# EasyEDA Pro project ProPrj_rk3568B2_2026-10-28.epro, board PCB1
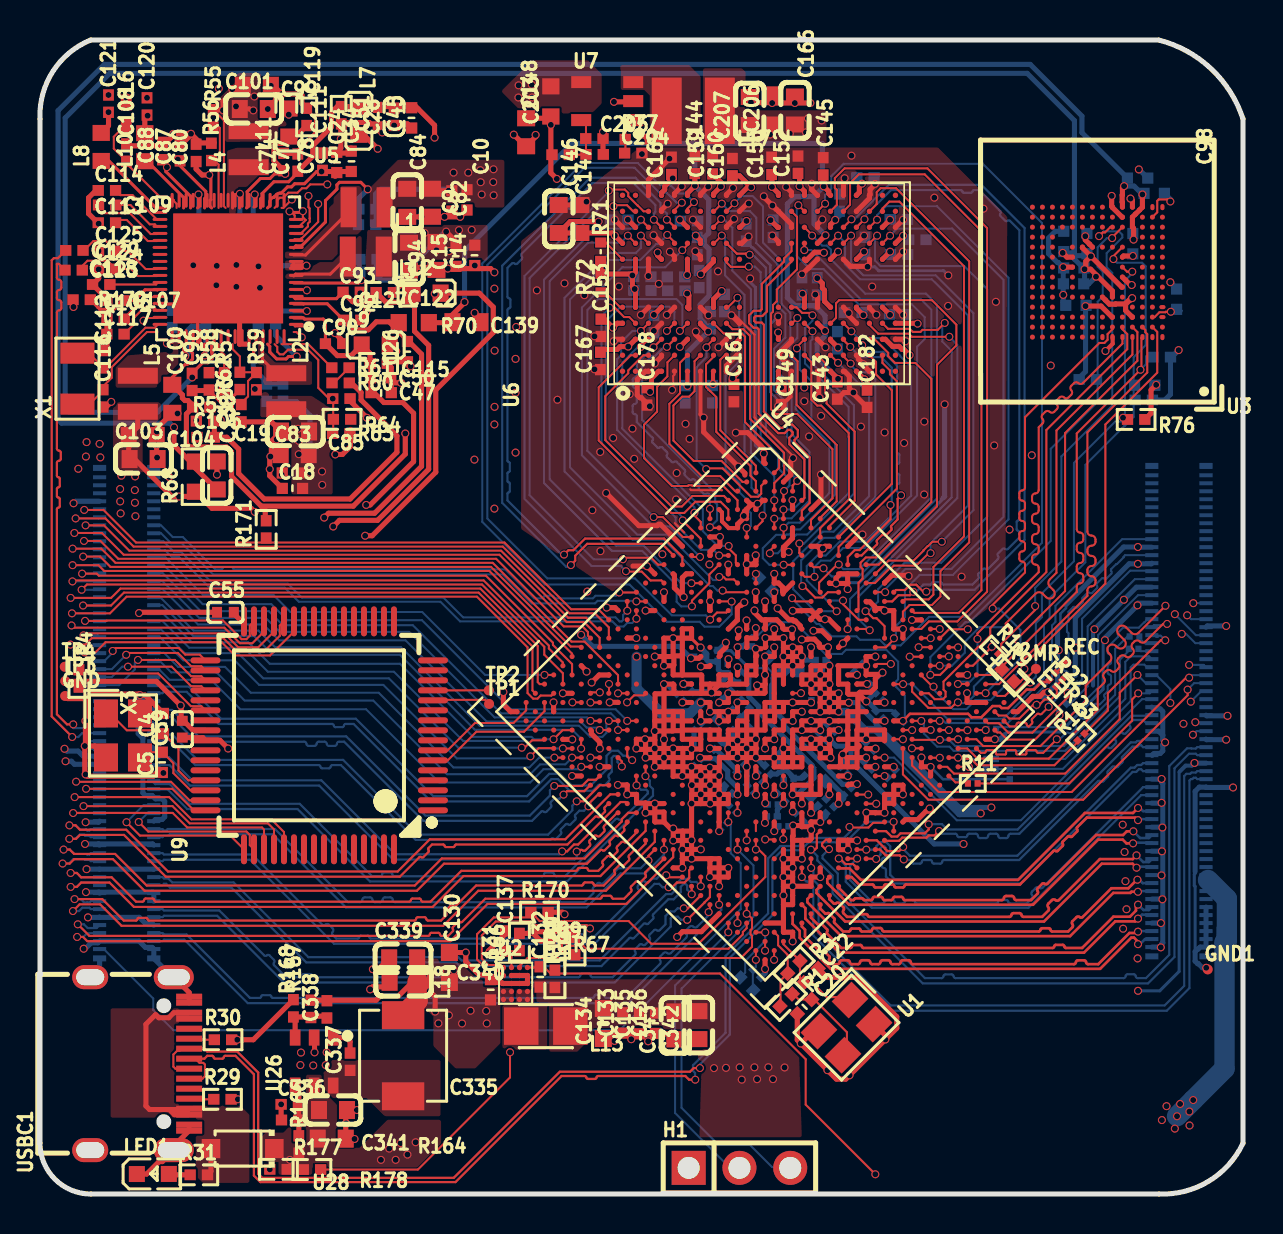
[diagram p19: board, top side]
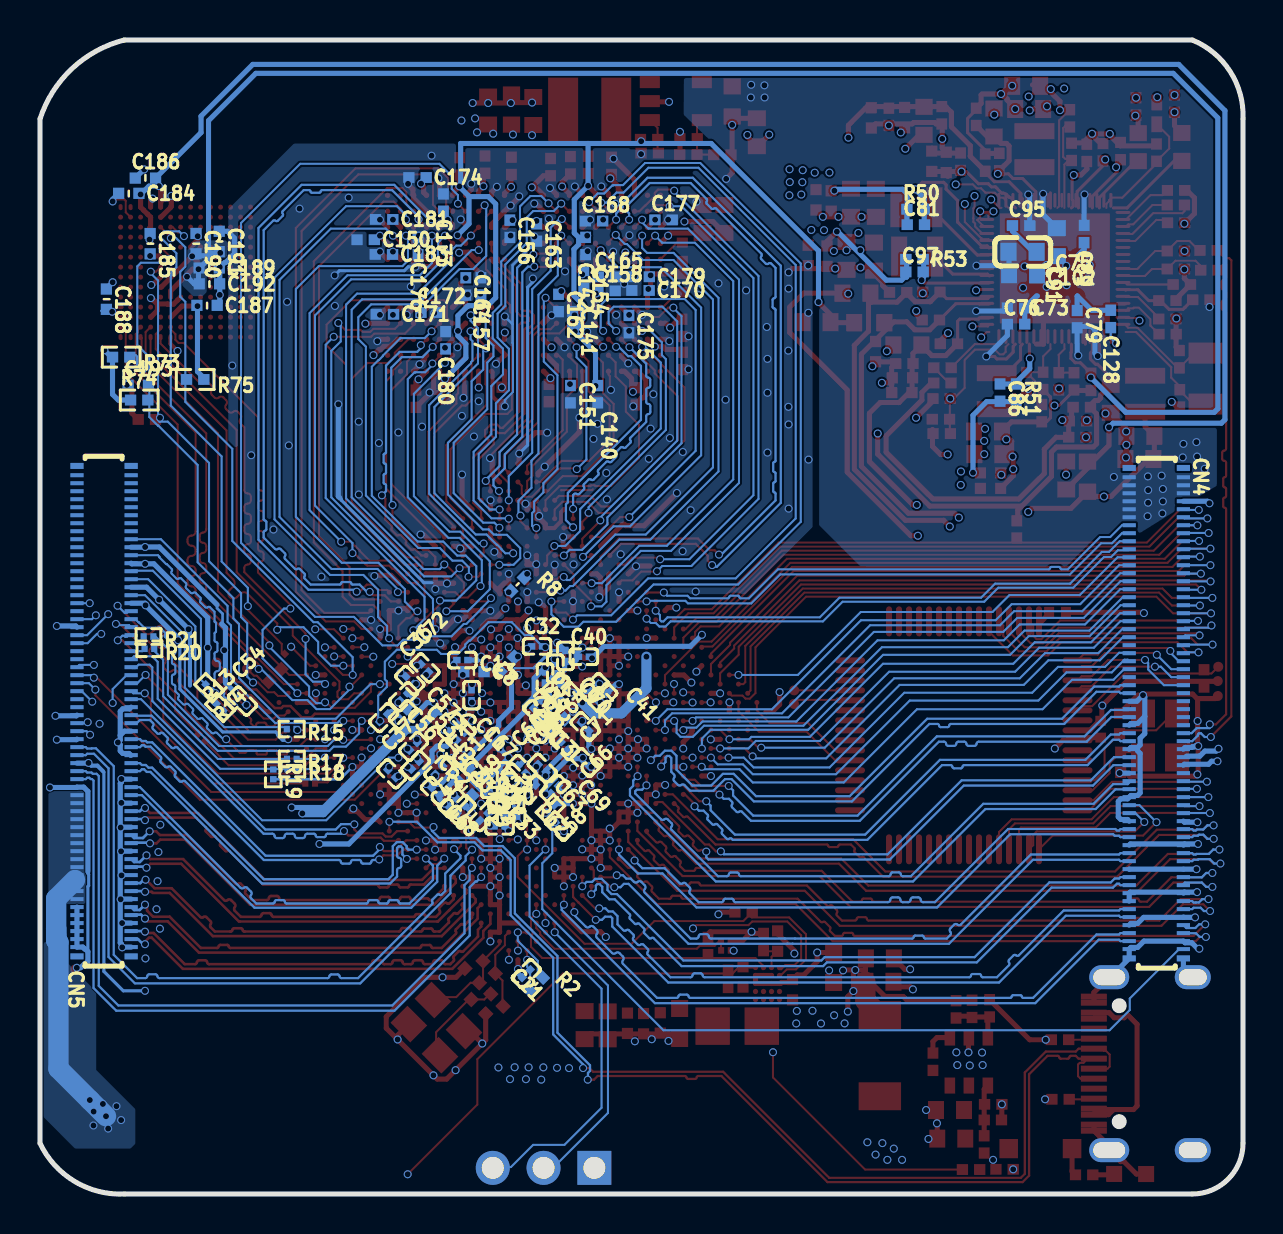
[diagram p20: board, bottom side, seen from below]

Outline 60.17 x 57.72 mm; copper layers: Top Layer, GND1, Inner2, Inner3, GND2, Bottom Layer. Coordinates in mm from the lower left corner of the outline.
Outline path: 0,53.77 arc(0.64,56.15) 2.54,57.72 55.94,57.72 arc(58.56,56.29) 60.17,53.77 60.17,2.54 arc(58.44,0.63) 55.94,0 2.54,0 arc(0.74,0.74) 0,2.54 0,53.77
Stack: Top Layer 0.035mm 外层铜厚1oz / Dielectric1 0.0994mm 3313 RC57% 4.2mil / GND1 0.0152mm 内层铜厚 / Dielectric2 0.55mm 0.55mm H/H No copper / Inner2 0.0152mm 内层铜厚 / Dielectric3 0.1088mm 2116 RC54% 4.9mil / Inner3 0.0152mm 内层铜厚 / Dielectric4 0.55mm 0.55mm H/H No copper / GND2 0.0152mm 内层铜厚 / Dielectric5 0.0994mm 3313 RC57% 4.2mil / Bottom Layer 0.035mm 外层铜厚1oz

## Design rules (mm)
net VDD_CPU: POWER
net GND: POWER
net VDD_LOGIC: POWER
net VDD_GPU: POWER
net VDD_NPU: POWER
net VCC3V3_PMU: POWER
net VDDA0V9_PMU: POWER
net VCCA1V8_PMU: POWER
net VDDA_0V9: POWER
net VCCA_1V8: POWER
net VCCIO_SD: POWER
net VCCIO_FLASH: POWER
net VCC_3V3: POWER
net USB_AVDD_1V8: POWER
net USB_AVDD_0V9: POWER
net VCCIO_WL: POWER
net VCC_1V8: POWER
net VDDA0V9_IMAGE: POWER
net VCCA1V8_IMAGE: POWER
net MIPI_AVDD_0V9: POWER
net MIPI_AVDD_1V8: POWER
net VCCIO_ACODEC: POWER
net VCC3V3_SYS: POWER
net VCC3V3_SD: POWER
net VCC_DDR: POWER
net SPKP_OUT: DP40
net SPKN_OUT: DP40
net MIC1_INP: DP39
net MIC1_INN: DP39
net VCC1V8_DDR: POWER
net VCC0V6_DDR: POWER
net EMMC_RSTN/FSPI_D2/FLASH_WPN: emmc
net MIPI_CSI_RX_D3P: DP28
net HDMI_TX0P_PORT: DP19
net MIPI_CSI_RX_D3N: DP28
net HDMI_TX0N_PORT: DP19
net MIPI_DSI_TX0_D0N/LVDS_TX0_D0N: DP25
net HDMI_TXCLKP_PORT: DP20
net MIPI_DSI_TX0_D0P/LVDS_TX0_D0P: DP25
net HDMI_TXCLKN_PORT: DP20
net MIPI_DSI_TX0_CLKN/LVDS_TX0_CLKN: DP26
net MIPI_DSI_TX0_D1N/LVDS_TX0_D1N: DP21
net MIPI_DSI_TX0_CLKP/LVDS_TX0_CLKP: DP26
net MIPI_DSI_TX0_D1P/LVDS_TX0_D1P: DP21
net MIPI_DSI_TX0_D3N/LVDS_TX0_D3N: DP24
net MIPI_DSI_TX0_D2N/LVDS_TX0_D2N: DP22
net MIPI_DSI_TX0_D3P/LVDS_TX0_D3P: DP24
net MIPI_DSI_TX0_D2P/LVDS_TX0_D2P: DP22
net MIPI_CSI_RX_D1N: DP27
net MIPI_CSI_RX_D0N: DP23
net MIPI_CSI_RX_D1P: DP27
net MIPI_CSI_RX_D0P: DP23
net MIPI_CSI_RX_CLK0N: DP29
net MIPI_CSI_RX_CLK0P: DP29
net MIPI_CSI_RX_CLK1N: DP30
net MIPI_CSI_RX_CLK1P: DP30
net USB2_HOST3_DP: DP38
net USB2_HOST3_DM: DP38
net USB2_HOST2_DP: DP37
net USB2_HOST2_DM: DP37
net MIPI_CSI_RX_D2P: DP34
net HDMI_TX1N_PORT: DP11
net MIPI_CSI_RX_D2N: DP34
net HDMI_TX1P_PORT: DP11
net HDMI_TX2N_PORT: DP10
net HDMI_TX2P_PORT: DP10
net GMAC0_RXCLK: PHYRXD
net GMAC0_TXD2: PHYTXD
net GMAC0_TXD3: PHYTXD
net GMAC0_RXDV_CRS: PHYRXD
net GMAC0_TXCLK: PHYTXD
net GMAC0_RXD2: PHYRXD
net GMAC0_RXD3: PHYRXD
net GMAC0_RXD0: PHYRXD
net GMAC0_TXD0: PHYTXD
net GMAC0_TXD1: PHYTXD
net GMAC0_RXD1: PHYRXD
net GMAC0_TXEN: PHYTXD
net USB3_OTG0_DP: DP31
net USB3_OTG0_DM: DP31
net USB3_OTG0_SSRXN: DP18
net USB3_HOST1_DP: DP35
net USB3_OTG0_SSRXP: DP18
net USB3_HOST1_DM: DP35
net USB3_OTG0_SSTXN: DP17
net PCIE20_REFCLKP: DP33
net USB3_OTG0_SSTXP: DP17
net PCIE20_REFCLKN: DP33
net USB3_HOST1_SSRXN: DP16
net PCIE30_REFCLKP_IN: DP32
net USB3_HOST1_SSRXP: DP16
net PCIE30_REFCLKN_IN: DP32
net USB3_HOST1_SSTXN: DP15
net USB3_HOST1_SSTXP: DP15
net PCIE20_TXP: DP14
net PCIE20_TXN: DP14
net PCIE20_RXP: DP13
net PCIE20_RXN: DP13
net PCIE30_TX0N: DP12
net PCIE30_TX0P: DP12
net PCIE30_TX1N: DP9
net PCIE30_TX1P: DP9
net PCIE30_RX0N: DP8
net PCIE30_RX0P: DP8
net PCIE30_RX1N: DP7
net PCIE30_RX1P: DP7
net VCC3V0_RTC: POWER
net EMMC_D0/FLASH_D0: emmc
net EMMC_CLKOUT/FLASH_DQS: emmc
net EMMC_CMD/FLASH_WRN: emmc
net EMMC_DATA_STROBE/FLASH_CLE: emmc
net EMMC_D1/FLASH_D1: emmc
net EMMC_D2/FLASH_D2: emmc
net EMMC_D3/FLASH_D3: emmc
net EMMC_D4/FLASH_D4: emmc
net EMMC_D5/FLASH_D5: emmc
net EMMC_D6/FLASH_D6: emmc
net EMMC_D7/FLASH_D7: emmc
net DDR_A_CS0: CMD_ADDR_CH_A
net DDR_A1_A: CMD_ADDR_CH_A
net DDR_A_CS1: CMD_ADDR_CH_A
net DDR_A_ODTCA: CMD_ADDR_CH_A
net DDR_A_CLKN: CMD_ADDR_CH_A, DP3
net DDR_DQ3_A: Data_CH_A_Byte0
net DDR_A_CKE0: CMD_ADDR_CH_A
net DDR_A0_A: CMD_ADDR_CH_A
net DDR_A_CLKP: CMD_ADDR_CH_A, DP3
net DDR_B_CLKN: CMD_ADDR_CH_B, DP2
net DDR_DQ1_A: Data_CH_A_Byte0
net DDR_A3_A: CMD_ADDR_CH_A
net DDR_DQ2_A: Data_CH_A_Byte0
net DDR_A4_A: CMD_ADDR_CH_A
net DDR_B_CLKP: CMD_ADDR_CH_B, DP2
net DDR_DQ0_A: Data_CH_A_Byte0
net DDR_A1_B: CMD_ADDR_CH_B
net DDR_A_DQS0P: Data_CH_A_Byte0, DP6
net DDR_A2_A: CMD_ADDR_CH_A
net DDR_A5_B: CMD_ADDR_CH_B
net DDR_A5_A: CMD_ADDR_CH_A
net DDR_A_DQS0N: Data_CH_A_Byte0, DP6
net DDR_B_ODTCA: CMD_ADDR_CH_B
net DDR_DQ6_A: Data_CH_A_Byte0
net DDR_A_CKE1: CMD_ADDR_CH_A
net DDR_A0_B: CMD_ADDR_CH_B
net DDR_B_CKE0: CMD_ADDR_CH_B
net DDR_DQ4_A: Data_CH_A_Byte0
net DDR_DQ1_B: Data_CH_B_Byte0
net DDR_B_CKE1: CMD_ADDR_CH_B
net DDR_DQ5_A: Data_CH_A_Byte0
net DDR_A_DQS1N: Data_CH_A_Byte1, DP1
net DDR_B_CS0: CMD_ADDR_CH_B
net DDR_DQ7_A: Data_CH_A_Byte0
net DDR_DQ12_A: Data_CH_A_Byte1
net DDR_DQ0_B: Data_CH_B_Byte0
net DDR_B_DQS0P: Data_CH_B_Byte0, DP4
net DDR_DQ8_A: Data_CH_A_Byte1
net DDR_DM0_A: Data_CH_A_Byte0
net DDR_A3_B: CMD_ADDR_CH_B
net DDR_DM1_A: Data_CH_A_Byte1
net DDR_B_CS1: CMD_ADDR_CH_B
net DDR_B_DQS0N: Data_CH_B_Byte0, DP4
net DDR_DQ4_B: Data_CH_B_Byte0
net DDR_A_DQS1P: Data_CH_A_Byte1, DP1
net DDR_DQ13_B: Data_CH_B_Byte1
net DDR_A4_B: CMD_ADDR_CH_B
net DDR_DQ13_A: Data_CH_A_Byte1
net DDR_DQ15_A: Data_CH_A_Byte1
net DDR_DQ12_B: Data_CH_B_Byte1
net DDR_DQ9_A: Data_CH_A_Byte1
net DDR_DQ15_B: Data_CH_B_Byte1
net DDR_DQ14_A: Data_CH_A_Byte1
net DDR_DQ2_B: Data_CH_B_Byte0
net DDR_A2_B: CMD_ADDR_CH_B
net DDR_B_DQS1N: Data_CH_B_Byte1, DP5
net DDR_DQ3_B: Data_CH_B_Byte0
net DDR_DQ11_A: Data_CH_A_Byte1
net DDR_RESET: CMD_ADDR_CH_B
net DDR_DQ8_B: Data_CH_B_Byte1
net DDR_B_DQS1P: Data_CH_B_Byte1, DP5
net DDR_DM0_B: Data_CH_B_Byte0
net DDR_DQ10_A: Data_CH_A_Byte1
net DDR_DQ10_B: Data_CH_B_Byte1
net DDR_DQ7_B: Data_CH_B_Byte0
net DDR_DQ9_B: Data_CH_B_Byte1
net DDR_DQ5_B: Data_CH_B_Byte0
net DDR_DQ11_B: Data_CH_B_Byte1
net DDR_DQ6_B: Data_CH_B_Byte0
net DDR_DQ14_B: Data_CH_B_Byte1
net DDR_DM1_B: Data_CH_B_Byte1
net VCC5V0_SYS: POWER
spacing copperThickness1oz (default): track to track 0.102, other pairs 0.089 to 0.3
spacing copperThickness2oz: track to track 0.203, other pairs 0.152 to 0.3
spacing 3W: track to track 0.102, other pairs 0.089 to 0.3
spacing Plane_innerPlane: track to track 0.102, other pairs 0.089 to 0.3
spacing Copper_copperRegion: track to track 0.102, other pairs 0.089 to 0.3
track width copperThickness2oz: min 0.203, default 0.254, max 2.54
track width 50ohm (default): min 0.102, default 0.102, max 2.54
track width trackWidth1: min 0.127, default 0.254, max 2.54
track width PWR: min 0.102, default 0.254, max 2.54
track width trackWidth2: min 0.127, default 0.254, max 2.54
differential pair differentialPair: width min 0.127, default 0.254, max 2.54; gap min 0.152, default 0.152
differential pair 90: width min 0.102, default 0.112, max 2.54; gap min 0.102, default 0.102
differential pair 100 (default): width min 0.109, default 0.109, max 2.54; gap min 0.152, default 0.152
differential pair 85: width min 0.127, default 0.131, max 2.54; gap min 0.102, default 0.102
net class POWER uses PWR
net class CMD_ADDR_CH_A uses 3W
net class Data_CH_A_Byte0 uses 3W
net class CMD_ADDR_CH_B uses 3W
net class Data_CH_B_Byte0 uses 3W
net class Data_CH_A_Byte1 uses 3W
net class Data_CH_B_Byte1 uses 3W
net VDD_CPU uses PWR
net GND uses PWR
net VDD_LOGIC uses PWR
net VDD_GPU uses PWR
net VDD_NPU uses PWR
net VCC3V3_PMU uses PWR
net VDDA0V9_PMU uses PWR
net VCCA1V8_PMU uses PWR
net VDDA_0V9 uses PWR
net VCCA_1V8 uses PWR
net VCCIO_SD uses PWR
net VCCIO_FLASH uses PWR
net VCC_3V3 uses PWR
net USB_AVDD_1V8 uses PWR
net USB_AVDD_0V9 uses PWR
net VCCIO_WL uses PWR
net VCC_1V8 uses PWR
net VDDA0V9_IMAGE uses PWR
net VCCA1V8_IMAGE uses PWR
net MIPI_AVDD_0V9 uses PWR
net MIPI_AVDD_1V8 uses PWR
net VCCIO_ACODEC uses PWR
net VCC3V3_SYS uses PWR
net VCC3V3_SD uses PWR
net VCC_DDR uses PWR
net SPKP_OUT uses differentialPair
net SPKN_OUT uses differentialPair
net VCC1V8_DDR uses PWR
net VCC0V6_DDR uses PWR
net USB2_HOST3_DP uses 90
net USB2_HOST3_DM uses 90
net USB2_HOST2_DP uses 90
net USB2_HOST2_DM uses 90
net USB3_OTG0_DP uses 90
net USB3_OTG0_DM uses 90
net USB3_OTG0_SSRXN uses 90
net USB3_HOST1_DP uses 90
net USB3_OTG0_SSRXP uses 90
net USB3_HOST1_DM uses 90
net USB3_OTG0_SSTXN uses 90
net USB3_OTG0_SSTXP uses 90
net USB3_HOST1_SSRXN uses 90
net USB3_HOST1_SSRXP uses 90
net USB3_HOST1_SSTXN uses 90
net USB3_HOST1_SSTXP uses 90
net PCIE20_TXP uses 85
net PCIE20_TXN uses 85
net PCIE20_RXP uses 85
net PCIE20_RXN uses 85
net PCIE30_TX0N uses 85
net PCIE30_TX0P uses 85
net PCIE30_TX1N uses 85
net PCIE30_TX1P uses 85
net PCIE30_RX0N uses 85
net PCIE30_RX0P uses 85
net PCIE30_RX1N uses 85
net PCIE30_RX1P uses 85
net VCC3V0_RTC uses PWR
net DDR_A_CS0 uses 3W, copperRegion_3W
net DDR_A1_A uses 3W, copperRegion_3W
net DDR_A_CS1 uses 3W, copperRegion_3W
net DDR_A_ODTCA uses 3W, copperRegion_3W
net DDR_A_CLKN uses 3W, copperRegion_3W
net DDR_DQ3_A uses 3W, copperRegion_3W
net DDR_A_CKE0 uses 3W, copperRegion_3W
net DDR_A0_A uses 3W, copperRegion_3W
net DDR_A_CLKP uses 3W, copperRegion_3W
net DDR_B_CLKN uses 3W, copperRegion_3W
net DDR_DQ1_A uses 3W, copperRegion_3W
net DDR_A3_A uses 3W, copperRegion_3W
net DDR_DQ2_A uses 3W, copperRegion_3W
net DDR_A4_A uses 3W, copperRegion_3W
net DDR_B_CLKP uses 3W, copperRegion_3W
net DDR_DQ0_A uses 3W, copperRegion_3W
net DDR_A1_B uses 3W, copperRegion_3W
net DDR_A_DQS0P uses 3W, copperRegion_3W
net DDR_A2_A uses 3W, copperRegion_3W
net DDR_A5_B uses 3W, copperRegion_3W
net DDR_A5_A uses 3W, copperRegion_3W
net DDR_A_DQS0N uses 3W, copperRegion_3W
net DDR_B_ODTCA uses 3W, copperRegion_3W
net DDR_DQ6_A uses 3W, copperRegion_3W
net DDR_A_CKE1 uses 3W, copperRegion_3W
net DDR_A0_B uses 3W, copperRegion_3W
net DDR_B_CKE0 uses 3W, copperRegion_3W
net DDR_DQ4_A uses 3W, copperRegion_3W
net DDR_DQ1_B uses 3W, copperRegion_3W
net DDR_B_CKE1 uses 3W, copperRegion_3W
net DDR_DQ5_A uses 3W, copperRegion_3W
net DDR_A_DQS1N uses 3W, copperRegion_3W
net DDR_B_CS0 uses 3W, copperRegion_3W
net DDR_DQ7_A uses 3W, copperRegion_3W
net DDR_DQ12_A uses 3W, copperRegion_3W
net DDR_DQ0_B uses 3W, copperRegion_3W
net DDR_B_DQS0P uses 3W, copperRegion_3W
net DDR_DQ8_A uses 3W, copperRegion_3W
net DDR_DM0_A uses 3W, copperRegion_3W
net DDR_A3_B uses 3W, copperRegion_3W
net DDR_DM1_A uses 3W, copperRegion_3W
net DDR_B_CS1 uses 3W, copperRegion_3W
net DDR_B_DQS0N uses 3W, copperRegion_3W
net DDR_DQ4_B uses 3W, copperRegion_3W
net DDR_A_DQS1P uses 3W, copperRegion_3W
net DDR_DQ13_B uses 3W, copperRegion_3W
net DDR_A4_B uses 3W, copperRegion_3W
net DDR_DQ13_A uses 3W, copperRegion_3W
net DDR_DQ15_A uses 3W, copperRegion_3W
net DDR_DQ12_B uses 3W, copperRegion_3W
net DDR_DQ9_A uses 3W, copperRegion_3W
net DDR_DQ15_B uses 3W, copperRegion_3W
net DDR_DQ14_A uses 3W, copperRegion_3W
net DDR_DQ2_B uses 3W, copperRegion_3W
net DDR_A2_B uses 3W, copperRegion_3W
net DDR_B_DQS1N uses 3W, copperRegion_3W
net DDR_DQ3_B uses 3W, copperRegion_3W
net DDR_DQ11_A uses 3W, copperRegion_3W
net DDR_RESET uses 3W, copperRegion_3W
net DDR_DQ8_B uses 3W, copperRegion_3W
net DDR_B_DQS1P uses 3W, copperRegion_3W
net DDR_DM0_B uses 3W, copperRegion_3W
net DDR_DQ10_A uses 3W, copperRegion_3W
net DDR_DQ10_B uses 3W, copperRegion_3W
net DDR_DQ7_B uses 3W, copperRegion_3W
net DDR_DQ9_B uses 3W, copperRegion_3W
net DDR_DQ5_B uses 3W, copperRegion_3W
net DDR_DQ11_B uses 3W, copperRegion_3W
net DDR_DQ6_B uses 3W, copperRegion_3W
net DDR_DQ14_B uses 3W, copperRegion_3W
net DDR_DM1_B uses 3W, copperRegion_3W
net VCC5V0_SYS uses PWR, copperRegion_copperThickness1oz
pour e2772 uses Copper_copperRegion, copperRegion_Copper_copperRegion
pour e2895 uses Copper_copperRegion, copperRegion_Copper_copperRegion
pour e3185 uses Copper_copperRegion, copperRegion_Copper_copperRegion
pour e3187 uses Copper_copperRegion, copperRegion_Copper_copperRegion
pour e3189 uses Copper_copperRegion, copperRegion_Copper_copperRegion
pour e3194 uses Copper_copperRegion, copperRegion_Copper_copperRegion
pour e3209 uses Copper_copperRegion, copperRegion_Copper_copperRegion
diff pair DP7 uses 85
diff pair DP8 uses 85
diff pair DP9 uses 85
pour e3235 uses Copper_copperRegion, copperRegion_Copper_copperRegion
diff pair DP12 uses 85
diff pair DP13 uses 85
diff pair DP14 uses 85
diff pair DP15 uses 90
diff pair DP16 uses 90
diff pair DP17 uses 90
diff pair DP18 uses 90
pour e3281 uses Copper_copperRegion, copperRegion_Copper_copperRegion
pour e3283 uses Copper_copperRegion, copperRegion_Copper_copperRegion
pour e3286 uses Copper_copperRegion, copperRegion_Copper_copperRegion
pour e3291 uses Copper_copperRegion, copperRegion_Copper_copperRegion
pour e3335 uses Copper_copperRegion, copperRegion_Copper_copperRegion
pour e3337 uses Copper_copperRegion, copperRegion_Copper_copperRegion
pour e3358 uses Copper_copperRegion, copperRegion_Copper_copperRegion
pour e3393 uses Copper_copperRegion, copperRegion_Copper_copperRegion
pour e3466 uses Copper_copperRegion, copperRegion_Copper_copperRegion
pour e3473 uses Copper_copperRegion, copperRegion_Copper_copperRegion
pour e3479 uses Copper_copperRegion, copperRegion_Copper_copperRegion
pour e3539 uses Copper_copperRegion, copperRegion_Copper_copperRegion
pour e3579 uses Copper_copperRegion, copperRegion_Copper_copperRegion
pour e3586 uses Copper_copperRegion, copperRegion_Copper_copperRegion
pour e3920 uses Copper_copperRegion, copperRegion_Copper_copperRegion
pour e3942 uses Copper_copperRegion, copperRegion_Copper_copperRegion
pour e3955 uses Copper_copperRegion, copperRegion_Copper_copperRegion
pour e4399 uses Copper_copperRegion, copperRegion_Copper_copperRegion
pour e4403 uses Copper_copperRegion, copperRegion_Copper_copperRegion
pour e4421 uses Copper_copperRegion, copperRegion_Copper_copperRegion
pour e4460 uses Copper_copperRegion, copperRegion_Copper_copperRegion
pour e4515 uses Copper_copperRegion, copperRegion_Copper_copperRegion
diff pair DP31 uses 90
diff pair DP35 uses 90
pour e4835 uses Copper_copperRegion, copperRegion_Copper_copperRegion
diff pair DP37 uses 90
diff pair DP38 uses 90
pour e4881 uses Copper_copperRegion, copperRegion_Copper_copperRegion
pour e4897 uses Copper_copperRegion, copperRegion_Copper_copperRegion
pour e6538 uses Copper_copperRegion, copperRegion_Copper_copperRegion
pour e9331 uses Copper_copperRegion, copperRegion_Copper_copperRegion
pour e9360 uses Copper_copperRegion, copperRegion_Copper_copperRegion
pour e9367 uses Copper_copperRegion, copperRegion_Copper_copperRegion
diff pair DP40 uses differentialPair

## Placement (name value [footprint] x y rotation side)
C1  0.1uF  [C0201]  39.04 26.71 0 bottom
C2  4.7uF  [C0201]  38.58 24.95 90 bottom
C3  22uF  [c0402-nsk]  38.46 26.13 0 bottom
C4  12pF  [c0402-nsk]  6.17 23.53 90 top
C5  12pF  [c0402-nsk]  6.12 21.59 90 top
C6  0.1uF  [C0201]  34.37 25.35 315 bottom
C7  4.7uF  [C0201]  33.91 24.91 315 bottom
C8  22uF  [c0402-nsk]  36.8 26.49 135 bottom
C9  22uF  [c0402-nsk]  21.36 49.72 90 top
C10  22uF  [c0402-nsk]  20.6 49.67 90 top
C11  0.1uF  [C0201]  34.85 24.02 135 bottom
C12  4.7uF  [C0201]  35.29 24.51 135 bottom
C13  22uF  [c0402-nsk]  34.29 23.4 135 bottom
C14  22uF  [c0402-nsk]  21.75 46.95 90 top
C15  22uF  [c0402-nsk]  20.81 46.9 90 top
C16  0.1uF  [C0201]  39.54 23.33 315 bottom
C17  4.7uF  [C0201]  39.12 22.89 315 bottom
C18  22uF  [c0402-nsk]  12.63 35.29 0 top
C19  22uF  [c0402-nsk]  12.62 36.07 0 top
C20  12pF  [c0402-nsk]  38.23 9.37 225 top
C21  100nF  [C0201]  35.85 11.02 135 bottom
C22  12pF  [c0402-nsk]  38.56 10.92 225 top
C23  100nF  [C0201]  36.65 19.48 180 bottom
C24  1uF  [c0402-nsk]  14.84 51.6 270 top
C25  100nF  [C0201]  37.06 19.85 135 bottom
C26  1uF  [c0402-nsk]  18.38 42.13 90 top
C27  100nF  [C0201]  37.18 18.39 180 bottom
C28  1uF  [C0402]  17.71 53.88 90 top
C29  100nF  [C0201]  34.91 25.83 90 bottom
C30  100nF  [C0201]  36.6 18.88 180 bottom
C31  1uF  [c0402-nsk]  38.92 20.28 225 bottom
C32  100nF  [C0201]  35.31 27.39 180 bottom
C33  100nF  [C0201]  37.96 18.87 315 bottom
C34  1uF  [c0402-nsk]  15.57 51.65 270 top
C35  100nF  [C0201]  41.48 22.39 315 bottom
C36  100nF  [C0201]  41.67 25.69 225 bottom
C37  100nF  [C0201]  42.58 21.02 225 bottom
C38  100nF  [C0201]  34.39 26.28 90 bottom
C39  100nF  [C0201]  33.89 26.91 90 bottom
C40  100nF  [C0201]  32.96 26.87 180 bottom
C41  100nF  [C0201]  32.02 24.83 315 bottom
C42  100nF  [C0201]  40.39 20.13 45 bottom
C43  100nF  [C0201]  40.22 21.19 315 bottom
C44  100nF  [C0201]  37.69 20.52 270 bottom
C45  4.7uF  [c0402-nsk]  18.59 53.82 90 top
C46  100nF  [C0201]  39.51 19.56 135 bottom
C47  4.7uF  [c0402-nsk]  17.06 40.08 180 top
C48  100nF  [C0201]  39.11 19.23 135 bottom
C49  100nF  [C0201]  38.42 21.11 45 bottom
C50  4.7uF  [c0402-nsk]  17.03 40.83 180 top
C51  4.7uF  [c0402-nsk]  16.92 53.84 90 top
C52  100nF  [C0201]  41.39 21.44 315 bottom
C53  100nF  [C0201]  42 23.97 315 bottom
C54  1nF  [C0201]  50.04 24.66 225 bottom
C55  470nF  [C0402_1]  9.27 29.09 0 top
C56  100nF  [C0201]  42.98 23.82 315 bottom
C57  100nF  [C0201]  41.98 24.87 315 bottom
C58  100nF  [C0201]  34.19 18.39 45 bottom
C59  100nF  [C0402_1]  7.12 23.25 90 top
C60  0.1uF  [C0201]  36.06 21.24 225 bottom
C61  1uF  [C0201]  36.35 20.81 225 bottom
C63  0.1uF  [C0201]  35.55 20.24 310.9 bottom
C64  0.1uF  [C0201]  33.91 22.43 225 bottom
C66  0.1uF  [C0201]  32.89 21.58 45 bottom
C68  100nF  [C0201]  35.05 21.3 225 bottom
C69  100nF  [C0201]  34.43 20.23 315 bottom
C70  100nF  [C0201]  32.44 25.32 135 bottom
C71  100nF  [C0201]  32.91 23.38 45 bottom
C72  0.1uF  [C0201]  40.91 26.31 225 bottom
C73  1uF  [R0402_2]  11.36 44.32 0 bottom
C74  1uF  [R0402_2]  12.19 51.62 90 top
C75  22uF  [C0603_2]  11.02 47.12 0 bottom
C76  10uF  [R0402_2]  11.35 43.51 180 bottom
C77  1uF  [R0402_2]  12.89 51.59 90 top
C78  1uF  [R0402_2]  14.13 51.63 90 top
C79  1uF  [R0402_2]  8.29 43.76 270 bottom
C80  1uF  [R0402_2]  7.81 52.07 90 top
C81  1uF  [R0402_2]  16.36 48.48 180 bottom
C82  10uF  [C0603_3]  19.61 49.58 90 top
C83  10uF  [C0603_3]  12.74 37.01 0 top
C84  22uF  [C0603_2]  18.37 49.57 270 top
C85  22uF  [C0603_2]  12.76 38.14 180 top
C86  1uF  [R0402_2]  12.15 40.08 270 bottom
C87  1uF  [R0402_2]  7 52.1 90 top
C88  1uF  [R0402_2]  6.13 52.16 90 top
C89  1uF  [R0402_2]  7.95 48.02 90 bottom
C90  1uF  [R0402_2]  14.71 42.53 0 top
C91  10uF  [C0603_3]  9.31 47.61 90 bottom
C92  1uF  [R0402_2]  15.62 43.71 0 top
C93  1uF  [R0402_2]  15.59 45.11 0 top
C94  10uF  [C0603_3]  19.83 46.92 90 top
C95  1uF  [R0402_2]  11.1 48.44 180 bottom
C96  1uF  [R0402_2]  7.61 40.62 270 top
C97  1uF  [R0402_2]  16.43 46.12 180 bottom
C98  22uF  [C0603_2]  18.46 46.88 270 top
C99  10uF  [C0603_3]  10.84 55.43 180 top
C100  10uF  [C0603_3]  6.62 39.77 270 top
C101  22uF  [C0603_2]  10.69 54.27 0 top
C102  10uF  [C0603_3]  11 46 0 bottom
C103  22uF  [C0603_2]  5.18 36.76 0 top
C104  10uF  [C0603_3]  5.14 37.92 180 top
C105  1uF  [R0402_2]  8.29 37.85 0 top
C106  1uF  [R0402_2]  3.78 43.77 0 top
C107  1uF  [R0402_2]  3.78 44.68 180 top
C108  10uF  [R0402_2]  4.33 52.09 270 top
C109  4.7uF  [R0402_2]  3.36 49.47 180 top
C111  100nF  [R0402_4]  15.07 53.96 90 top
C112  12pF  [R0402_3]  3.18 41.75 270 top
C113  1uF  [R0402_2]  3.35 48.58 0 top
C114  1uF  [R0402_2]  3.35 50.2 0 top
C115  100nF  [R0402_4]  16.94 41.54 180 top
C116  12pF  [R0402_3]  3.16 39.79 270 top
C117  1uF  [R0402_2]  3.77 43.01 0 top
C118  1uF  [R0402_2]  3.06 45.49 0 top
C119  100nF  [R0402_4]  13.34 53.87 270 top
C120  680pF  [R0402_2]  5.35 54.4 270 top
C121  680pF  [R0402_2]  3.43 54.54 270 top
C122  100nF  [R0402_4]  17.25 45.1 180 top
C123  100nF  [R0402_2]  1.68 46.21 180 top
C124  27pF  [R0402_2]  3.36 46.26 0 top
C125  27pF  [R0402_2]  3.36 47.17 0 top
C126  100nF  [R0402_2]  10.07 39.05 90 top
C127  100nF  [R0402_2]  15.07 39.78 180 top
C128  100nF  [R0402_2]  6.62 43.77 90 bottom
C129  100nF  [R0402_2]  1.72 47.2 180 top
C130  22uF  [c0603-nsk]  20.47 11.33 270 top
C131  100nF  [c0402-nsk]  22.53 10.22 270 top
C132  100nF  [c0402-nsk]  25.01 10.86 270 top
C133  22uF  [c0402-nsk]  29.14 8.56 90 top
C134  22uF  [c0603-nsk]  28.17 8.53 90 top
C135  1uF  [c0402-nsk]  29.98 8.52 90 top
C136  100nF  [c0402-nsk]  30.78 8.54 90 top
C137  100nF  [c0402-nsk]  23.28 12.65 270 top
C138  100nF  [C0603]  8.84 35.94 270 top
C139  10uF  [C0603_3]  21.33 43.61 180 top
C140  100nF  [R0402_2]  32.27 40 90 bottom
C141  100nF  [R0402_2]  33.53 43.7 270 bottom
C142  100nF  [R0402_2]  32.88 47.41 90 bottom
C143  100nF  [R0402_2]  39.88 40.19 90 top
C144  100nF  [R0402_2]  32.75 51.47 270 top
C145  100nF  [R0402_2]  39.17 51.4 270 top
C146  22uF  [C0603_2]  25.94 48.77 270 top
C147  10uF  [C0603_3]  27.03 48.76 270 top
C148  10uF  [C0603_3]  24.31 53.1 270 top
C149  1uF  [R0402_2]  37.07 39.92 90 top
C150  100nF  [R0402_2]  43.88 47.73 0 bottom
C151  100nF  [R0402_2]  33.63 40 270 bottom
C152  100nF  [R0402_2]  37.91 51.48 90 top
C153  100nF  [R0402_2]  28.05 43.32 270 top
C154  100nF  [R0402_2]  32.97 45.76 270 bottom
C155  100nF  [R0402_2]  36.59 51.42 90 top
C156  100nF  [R0402_2]  36.67 48.28 270 bottom
C157  100nF  [R0402_2]  38.11 45.4 90 bottom
C158  100nF  [R0402_2]  31.83 45.17 180 bottom
C159  100nF  [R0402_2]  33.64 51.45 90 top
C160  100nF  [R0402_2]  34.63 51.36 90 top
C161  100nF  [R0402_2]  34.7 40.06 270 top
C162  100nF  [R0402_2]  34.23 44.57 270 bottom
C163  100nF  [R0402_2]  35.32 48.09 270 bottom
C164  100nF  [R0402_2]  38.87 45.39 270 bottom
C165  100nF  [R0402_2]  31.81 45.87 180 bottom
C166  22uF  [C0603_2]  37.76 54.19 270 top
C167  10uF  [R0402_2]  28.03 41.67 90 top
C168  10uF  [R0402_2]  32.46 48.66 180 bottom
C169  100nF  [R0402_2]  31.58 51.43 90 top
C170  100nF  [R0402_2]  30.13 45.19 0 bottom
C171  100nF  [R0402_2]  42.92 44 0 bottom
C172  100nF  [R0402_2]  40.68 44.09 180 bottom
C173  100nF  [R0402_2]  39.99 49.59 90 bottom
C174  100nF  [R0402_2]  41.28 50.84 0 bottom
C175  100nF  [R0402_2]  30.71 43.51 270 bottom
C176  100nF  [R0402_2]  41.26 47.42 90 bottom
C177  100nF  [R0402_2]  28.98 48.72 180 bottom
C178  100nF  [R0402_2]  30.36 39.89 270 top
C179  100nF  [R0402_2]  30.12 45.88 0 bottom
C180  100nF  [R0402_2]  39.88 42.7 90 bottom
C181  100nF  [R0402_2]  42.95 48.75 0 bottom
C182  100nF  [R0402_2]  41.36 39.78 270 top
C183  100nF  [R0402_2]  42.97 46.99 0 bottom
C184  100nF  [c0402-nsk]  55.73 50.05 0 bottom
C185  4.7uF  [c0402-nsk]  54.66 47.53 270 bottom
C186  100nF  [c0402-nsk]  54.89 50.81 180 bottom
C187  4.7uF  [c0402-nsk]  51.81 44.45 0 bottom
C188  2.2uF  [c0402-nsk]  56.84 44.75 270 bottom
C189  100nF  [c0402-nsk]  51.71 46.32 0 bottom
C190  4.7uF  [c0402-nsk]  52.36 47.53 270 bottom
C191  100nF  [c0402-nsk]  51.2 47.64 270 bottom
C192  4.7uF  [c0402-nsk]  51.69 45.52 0 bottom
C193  100nF  [c0402-nsk]  55.25 40.45 180 bottom
C203  NC  [R0603_1]  25.55 54.65 90 top
C204  NC  [R0402_2]  29.67 52.06 0 top
C205  NC  [R0402_2]  27.73 52.79 0 top
C206  NC  [R0603_1]  36.59 54.24 90 top
C207  22uF  [C0603_2]  35.5 54.17 90 top
C335  100nF  [C0603]  14.65 4.2 180 top
C336  100nF  [R0402_2]  12.49 4.48 0 top
C337  100nF  [R0402_2]  15.51 6.62 90 top
C338  22pF  [R0402_2]  14.35 9.24 90 top
C339  22uF  [C0603_2]  18.16 11.79 0 top
C340  100nF  [C0603]  18.18 10.61 0 top
C341  10uF  [C0603_3]  14.59 2.77 180 top
C342  22uF  [C0603]  32.93 8.45 90 top
C343  22uF  [C0603]  31.78 8.43 90 top
CN4  DF40C-120DP-0.4V(51)  [CONN-SMD_120P-P0.40_DF40C-120DP-0.4V-51]  4.34 24.05 270 bottom
CN5  DF40C-120DP-0.4V(51)  [CONN-SMD_120P-P0.40_DF40C-120DP-0.4V-51]  56.96 24.15 90 bottom
GND  -  [Test-Point-0.5mm]  1.26 24.91 0 top
GND1  -  [Test-Point-0.5mm]  58.4 11.23 0 top
H1  -  [HDR-TH_3P-P2.54-V-M_1]  34.98 1.31 0 top
L1  470nH  [IND-SMD_L2.0-W1.6_MHCHL201610A-1R0M-Q8A]  16.33 49.35 180 top
L2  470nH  [IND-SMD_L2.0-W1.6_MHCHL201610A-1R0M-Q8A]  12.32 40.15 270 top
L3  470nH  [IND-SMD_L2.0-W1.6_MHCHL201610A-1R0M-Q8A]  16.29 46.89 180 top
L4  470nH  [IND-SMD_L2.0-W1.6_MHCHL201610A-1R0M-Q8A]  10.43 52.26 90 top
L5  470nH  [IND-SMD_L2.0-W1.6_MHCHL201610A-1R0M-Q8A]  4.89 40.03 270 top
L6  BLM15AG121SN1D  [L0402]  4.31 54.05 270 top
L7  BLM18PG121SN1D  [L0603_1]  15.95 53.68 270 top
L8  BLM18PG181SN1D  [L0603]  3.06 52.37 90 top
L9  BLM18PG121SN1D  [L0603_1]  16.79 42.46 0 top
L10  BLM18PG181SN1D  [L0603]  5.24 52.36 90 top
L11  BLM18PG121SN1D  [L0603_1]  12.45 53.59 90 top
L12  BLM18PG121SN1D  [L0603_1]  19.34 45.06 0 top
L13  240nH  [IND-SMD_L2.5-W2.0_WPN252012H]  25.3 8.4 180 top
L17  NC  [IND-SMD_L3.0-W3.0]  32.67 54.18 180 top
L18  3.3uH  [IND-SMD_L4.4-W4.2]  18.16 6.92 270 top
LED1  -  [LED_0603]  5.69 1.01 0 top
MR  -  [Test-Point-0.5mm]  49.81 26.27 0 top
R1  22R  [R0402]  37.31 9.7 225 top
R2  0Ω  [r0402-nsk]  35.34 10.5 315 bottom
R3  1M  [R0402]  37.7 11.34 225 top
R4  5.1K  [R0402_1]  1.95 25.79 270 top
R8  120Ω  [r0402-nsk]  36.28 30.49 315 bottom
R9  100  [R0402]  48.41 25.94 315 top
R10  22R  [R0201]  47.75 27.19 315 top
R11  22  [R0201]  46.65 20.54 0 top
R12  200  [R0201]  37.19 20.96 90 bottom
R13  22  [R0201]  51.71 25.32 45 bottom
R14  22  [R0201]  51.17 24.34 45 bottom
R15  22  [R0201]  47.58 23.25 0 bottom
R16  22  [R0201]  52.06 22.85 45 top
R17  22  [R0201]  47.57 21.76 0 bottom
R18  22  [R0201]  47.55 21.25 0 bottom
R19  4.7K  [R0201]  48.5 20.99 270 bottom
R20  22  [R0201]  54.69 27.27 0 bottom
R21  22  [R0201]  54.74 27.88 0 bottom
R22  10K  [R0201]  50.65 25.55 315 top
R23  100  [R0201]  50.95 25.89 135 top
R29  5.1K  [R0402_1]  9.12 4.74 0 top
R30  5.1K  [R0402_1]  9.15 7.72 0 top
R31  5.1K  [R0402_1]  7.94 0.96 0 top
R32  1.62K  [R0201]  34.64 19.25 135 bottom
R50  0402WGF1000TCE  [R0402_2]  16.38 49.26 180 bottom
R51  0402WGF1000TCE  [R0402_2]  11.34 40.08 270 bottom
R52  0Ω  [R0402_2]  8.25 38.66 0 top
R53  0402WGF1000TCE  [R0402_2]  16.43 46.75 0 bottom
R54  0Ω  [R0402_2]  8.06 39.36 0 top
R55  47kΩ  [R0402_2]  8.66 53.8 270 top
R56  120kΩ  [R0402_2]  8.57 52.12 270 top
R57  0Ω  [R0402_2]  9.22 40.65 270 top
R58  NC  [R0402_2]  8.45 40.65 270 top
R59  180kΩ  [R0402_2]  10.83 40.65 270 top
R60  10kΩ  [R0402_2]  15.04 40.57 180 top
R61  0Ω  [R0402_2]  15.03 41.33 180 top
R62  56kΩ  [R0402_2]  10 40.67 90 top
R63  10kΩ  [R0402_2]  15.07 38.03 180 top
R64  22R  [R0402]  15.11 38.75 180 top
R65  100Ω  [R0402]  25.75 10.76 270 top
R66  51kΩ  [R0402]  23.98 12.6 90 top
R67  10K  [R0201]  25.87 12.66 180 top
R68  0  [R0603]  7.78 35.88 90 top
R69  2.2K  [R0201]  25.86 12.18 0 top
R70  0Ω  [R0603_2]  18.69 43.58 180 top
R71  240  [r0402-nsk]  28.04 47.13 270 top
R72  240  [r0402-nsk]  28.06 45.56 90 top
R73  10K  [R0402]  56.11 41.86 0 bottom
R74  10K  [R0402]  55.2 39.71 180 bottom
R75  10K  [R0402]  52.41 40.74 0 bottom
R76  47K  [R0402]  54.82 38.74 180 top
R77  NC  [R0402_2]  29.7 52.75 0 top
R78  NC  [R0402_2]  27.74 52 180 top
R79  NC  [R0402_2]  26.04 51.98 180 top
R164  30kΩ  [R0402_2]  12.51 3.7 0 top
R166  47kΩ  [R0402_2]  12.94 2.48 270 top
R167  33kΩ  [R0402_2]  12.67 9.29 270 top
R168  150kΩ  [R0402_3]  13.55 9.26 90 top
R169  2K  [R0402]  26.76 12.4 90 top
R170  2K  [R0402]  24.98 14.09 0 top
R171  10K  [R0402]  11.31 33.24 90 top
R177  10K  [R0402_1]  13.6 1.22 0 top
R178  15K  [R0402_1]  11.93 1.23 0 top
R179  0Ω  [R0402_2]  2.09 44.73 180 top
REC  -  [Test-Point-0.5mm]  51.33 26.58 0 top
TP1  -  [Test-Point-0.5mm_1]  22.46 24.51 0 top
TP2  -  [Test-Point-0.5mm_1]  22.45 25.19 0 top
TP3  -  [Test-Point-0.5mm_1]  1.26 25.66 0 top
TP4  -  [Test-Point-0.5mm_1]  1.24 26.37 0 top
U1  24MHz  [CRYSTAL-SMD_4P-L3.2-W2.5-BL]  40.34 8.32 225 top
U2  -  [TCS4525]  23.18 11.33 0 top
U3  -  [fbga-153_l13.0-w11.5-p0.50_klmag1jetd-b041]  52.88 46.11 180 top
U4  -  [BGA-636_L19.0-W19.0-P0.65-BL]  36.23 24 315 top
U5  -  [RK809-5]  9.28 45.91 180 top
U6  -  [LPDDR4_MrX]  35.96 45.55 90 top
U7  NC  [SOT-23-5_L3.0-W1.7-P0.95-LS2.8-BR]  28.37 54.66 0 top
U9  MSPM0G3507SPMR  [LQFP-64_L10.0-W10.0-P0.50-LS12.0-BL_1]  13.97 22.94 90 top
U26  SY8113BADC  [TSOT-23-6_L2.9-W1.6-P0.95-LS2.8-BR]  13.71 6.62 90 top
U28  SMF5.0A  [SOD-123FL_L2.8-W1.7-LS3.6-RD]  10.13 2.27 180 top
USBC1  TYPE-C-31-M-12  [USB-C_SMD-TYPE-C-31-M-12]  4.99 6.52 270 top
X1  32.768kHz  [CRYSTAL-SMD_L3.2-W1.5-1]  1.87 40.78 90 top
X3  40MHz  [CRYSTAL-SMD_4P-L3.2-W2.5-BL_1]  4.15 22.93 270 top

## Footprints (pads in the part's own frame, mm; a bottom-side part is the same pattern mirrored in y, then rotated)
BGA-636_L19.0-W19.0-P0.65-BL
  round 0.254 smd: A1(-8.844,8.886) A2(-8.194,8.885) A3(-7.544,8.886) A4(-6.894,8.885) A5(-6.244,8.886) A6(-5.594,8.885) A7(-4.944,8.886) A8(-4.294,8.885) A9(-3.644,8.886) A10(-2.994,8.885) A11(-2.344,8.886) A12(-1.694,8.885) A13(-1.044,8.886) A14(-0.395,8.886) A15(0.256,8.886) A16(0.906,8.886) A17(1.556,8.885) A18(2.206,8.886) A19(2.856,8.885) A20(3.506,8.886) A21(4.156,8.885) A22(4.806,8.886) A23(5.456,8.885) A24(6.106,8.886) A25(6.756,8.885) A26(7.406,8.886) A27(8.056,8.885) A28(8.706,8.886) AA1(-8.844,-4.114) AA2(-8.194,-4.114) AA3(-7.544,-4.114) AA4(-6.894,-4.114) AA5(-6.244,-4.114) AA6(-5.594,-4.114) AA7(-4.944,-4.115) AA9(-3.644,-4.114) AA11(-2.345,-4.114) AA12(-1.694,-4.114) AA14(-0.394,-4.114) AA15(0.256,-4.114) AA17(1.556,-4.114) AA18(2.206,-4.114) AA20(3.506,-4.114) AA22(4.806,-4.115) AA23(5.456,-4.114) AA24(6.106,-4.114) AA25(6.756,-4.114) AA26(7.405,-4.114) AA27(8.056,-4.114) AA28(8.706,-4.114) AB1(-8.844,-4.764) AB2(-8.194,-4.764) AB5(-6.244,-4.764) AB6(-5.594,-4.764) AB8(-4.295,-4.764) AB9(-3.644,-4.764) AB11(-2.344,-4.764) AB12(-1.694,-4.764) AB14(-0.395,-4.764) AB15(0.256,-4.764) AB17(1.556,-4.764) AB18(2.206,-4.764) AB20(3.506,-4.764) AB21(4.156,-4.764) AB23(5.455,-4.764) AB24(6.106,-4.764) AB27(8.056,-4.764) AB28(8.706,-4.764) AC1(-8.844,-5.415) AC2(-8.194,-5.415) AC3(-7.544,-5.415) AC4(-6.894,-5.415) AC5(-6.244,-5.415) AC7(-4.944,-5.415) AC8(-4.294,-5.415) AC9(-3.644,-5.415) AC11(-2.345,-5.415) AC12(-1.694,-5.415) AC14(-0.394,-5.415) AC15(0.256,-5.415) AC17(1.556,-5.415) AC18(2.206,-5.415) AC20(3.506,-5.415) AC21(4.156,-5.415) AC22(4.806,-5.415) AC24(6.106,-5.415) AC25(6.756,-5.415) AC26(7.405,-5.415) AC27(8.056,-5.415) AC28(8.706,-5.415) AD1(-8.844,-6.064) AD2(-8.194,-6.064) AD3(-7.544,-6.065) AD4(-6.894,-6.064) AD6(-5.594,-6.064) AD7(-4.944,-6.064) AD8(-4.294,-6.065) AD9(-3.644,-6.064) AD11(-2.344,-6.064) AD12(-1.694,-6.065) AD14(-0.395,-6.064) AD15(0.256,-6.064) AD17(1.556,-6.064) AD18(2.206,-6.065) AD20(3.506,-6.064) AD21(4.156,-6.064) AD22(4.806,-6.064) AD23(5.456,-6.064) AD25(6.755,-6.064) AD26(7.406,-6.064) AD27(8.056,-6.064) AD28(8.706,-6.064) AE1(-8.844,-6.715) AE2(-8.194,-6.715) AE3(-7.544,-6.715) AE5(-6.244,-6.715) AE6(-5.594,-6.715) AE8(-4.294,-6.715) AE9(-3.644,-6.715) AE11(-2.345,-6.715) AE12(-1.694,-6.715) AE14(-0.394,-6.715) AE15(0.256,-6.715) AE17(1.556,-6.715) AE18(2.206,-6.715) AE20(3.506,-6.715) AE21(4.156,-6.715) AE23(5.456,-6.715) AE24(6.106,-6.714) AE26(7.405,-6.715) AE27(8.056,-6.715) AE28(8.706,-6.715) AF1(-8.844,-7.364) AF2(-8.194,-7.364) AF3(-7.544,-7.364) AF4(-6.894,-7.364) AF5(-6.244,-7.364) AF6(-5.594,-7.364) AF8(-4.294,-7.364) AF9(-3.644,-7.364) AF11(-2.344,-7.364) AF12(-1.694,-7.364) AF14(-0.395,-7.364) AF15(0.256,-7.364) AF17(1.556,-7.364) AF18(2.206,-7.364) AF20(3.506,-7.364) AF21(4.156,-7.364) AF23(5.456,-7.364) AF24(6.106,-7.364) AF25(6.756,-7.364) AF26(7.406,-7.364) AF27(8.056,-7.364) AF28(8.706,-7.364) AG1(-8.844,-8.014) AG2(-8.194,-8.014) AG3(-7.544,-8.014) AG4(-6.894,-8.014) AG5(-6.244,-8.014) AG6(-5.594,-8.014) AG7(-4.944,-8.014) AG8(-4.294,-8.014) AG9(-3.644,-8.014) AG10(-2.994,-8.014) AG11(-2.344,-8.014) AG12(-1.694,-8.014) AG13(-1.044,-8.014) AG14(-0.394,-8.014) AG15(0.256,-8.014) AG16(0.906,-8.014) AG17(1.556,-8.014) AG18(2.206,-8.014) AG19(2.856,-8.014) AG20(3.506,-8.014) AG21(4.156,-8.014) AG22(4.806,-8.014) AG23(5.456,-8.014) AG24(6.106,-8.014) AG25(6.756,-8.014) AG26(7.406,-8.014) AG27(8.056,-8.014) AG28(8.706,-8.014) AH1(-8.844,-8.665) AH2(-8.194,-8.665) AH3(-7.544,-8.665) AH4(-6.894,-8.665) AH5(-6.244,-8.665) AH6(-5.594,-8.665) AH7(-4.944,-8.665) AH8(-4.294,-8.665) AH9(-3.644,-8.665) AH10(-2.994,-8.665) AH11(-2.344,-8.665) AH12(-1.694,-8.665) AH13(-1.044,-8.665) AH14(-0.395,-8.665) AH15(0.256,-8.665) AH16(0.906,-8.665) AH17(1.556,-8.665) AH18(2.206,-8.665) AH19(2.856,-8.665) AH20(3.506,-8.665) AH21(4.156,-8.665) AH22(4.806,-8.665) AH23(5.456,-8.665) AH24(6.106,-8.665) AH25(6.756,-8.665) AH26(7.406,-8.665) AH27(8.056,-8.665) AH28(8.706,-8.665) B1(-8.844,8.236) B2(-8.194,8.236) B3(-7.544,8.235) B4(-6.894,8.236) B5(-6.244,8.235) B6(-5.594,8.236) B7(-4.944,8.235) B8(-4.294,8.235) B9(-3.644,8.235) B10(-2.994,8.236) B11(-2.344,8.235) B12(-1.694,8.236) B13(-1.044,8.236) B14(-0.394,8.236) B15(0.256,8.236) B16(0.906,8.236) B17(1.556,8.236) B18(2.206,8.235) B19(2.856,8.236) B20(3.506,8.235) B21(4.156,8.236) B22(4.806,8.235) B23(5.456,8.235) B24(6.106,8.235) B25(6.756,8.235) B26(7.406,8.235) B27(8.056,8.236) B28(8.706,8.236) C1(-8.844,7.585) C2(-8.194,7.585) C3(-7.544,7.585) C4(-6.894,7.585) C5(-6.244,7.585) C6(-5.594,7.585) C8(-4.294,7.585) C9(-3.644,7.585) C11(-2.344,7.585) C12(-1.694,7.585) C14(-0.395,7.585) C15(0.256,7.585) C17(1.556,7.585) C18(2.206,7.585) C20(3.506,7.585) C21(4.156,7.585) C23(5.456,7.585) C24(6.106,7.585) C25(6.756,7.585) C26(7.406,7.585) C27(8.056,7.585) C28(8.706,7.585) D1(-8.844,6.936) D2(-8.194,6.936) D3(-7.544,6.936) D5(-6.244,6.936) D6(-5.594,6.936) D8(-4.294,6.936) D9(-3.644,6.936) D11(-2.345,6.936) D12(-1.694,6.936) D14(-0.394,6.936) D15(0.256,6.936) D17(1.556,6.936) D18(2.206,6.936) D20(3.506,6.936) D21(4.156,6.936) D23(5.456,6.936) D24(6.106,6.936) D26(7.405,6.936) D27(8.056,6.936) D28(8.706,6.936) E1(-8.844,6.285) E2(-8.194,6.285) E3(-7.544,6.285) E4(-6.894,6.285) E6(-5.594,6.285) E7(-4.944,6.285) E8(-4.294,6.285) E9(-3.644,6.285) E11(-2.344,6.285) E12(-1.694,6.285) E14(-0.395,6.285) E15(0.256,6.285) E17(1.556,6.285) E18(2.206,6.285) E20(3.506,6.285) E21(4.156,6.285) E22(4.806,6.285) E23(5.456,6.285) E25(6.755,6.285) E26(7.406,6.285) E27(8.056,6.285) E28(8.706,6.285) F1(-8.844,5.636) F2(-8.194,5.636) F3(-7.544,5.636) F4(-6.894,5.636) F5(-6.244,5.636) F7(-4.944,5.636) F8(-4.294,5.636) F9(-3.644,5.636) F11(-2.345,5.636) F12(-1.694,5.636) F14(-0.394,5.636) F15(0.256,5.636) F17(1.556,5.636) F18(2.206,5.636) F20(3.506,5.636) F21(4.156,5.636) F22(4.806,5.636) F24(6.106,5.636) F25(6.756,5.636) F26(7.405,5.636) F27(8.056,5.636) F28(8.706,5.636) G1(-8.844,4.985) G2(-8.194,4.986) G5(-6.244,4.986) G6(-5.594,4.986) G8(-4.295,4.986) G9(-3.644,4.986) G11(-2.344,4.986) G12(-1.694,4.985) G14(-0.395,4.985) G15(0.256,4.986) G17(1.556,4.986) G18(2.206,4.985) G20(3.506,4.985) G21(4.156,4.986) G23(5.455,4.986) G24(6.106,4.986) G27(8.056,4.986) G28(8.706,4.985) H1(-8.844,4.335) H2(-8.194,4.335) H3(-7.544,4.335) H4(-6.894,4.335) H5(-6.244,4.335) H6(-5.594,4.335) H7(-4.944,4.335) H9(-3.644,4.335) H11(-2.345,4.335) H12(-1.694,4.335) H14(-0.394,4.335) H15(0.256,4.335) H17(1.556,4.335) H18(2.206,4.335) H20(3.506,4.335) H22(4.806,4.335) H23(5.456,4.335) H24(6.106,4.335) H25(6.756,4.335) H26(7.405,4.335) H27(8.056,4.335) H28(8.706,4.335) J1(-8.844,3.686) J2(-8.194,3.686) J3(-7.544,3.686) J4(-6.894,3.686) J5(-6.244,3.686) J6(-5.594,3.686) J7(-4.944,3.686) J8(-4.294,3.686) J9(-3.644,3.686) J11(-2.344,3.686) J12(-1.694,3.686) J14(-0.395,3.686) J15(0.256,3.686) J17(1.556,3.686) J18(2.206,3.686) J20(3.506,3.686) J21(4.156,3.686) J22(4.806,3.686) J23(5.456,3.686) J24(6.106,3.686) J25(6.755,3.686) J26(7.406,3.686) J27(8.056,3.686) J28(8.706,3.686) K1(-8.844,3.035) K2(-8.194,3.036) K10(-2.994,3.035) K11(-2.345,3.035) K12(-1.694,3.036) K13(-1.044,3.036) K14(-0.394,3.036) K15(0.256,3.035) K16(0.906,3.035) K17(1.556,3.035) K18(2.206,3.035) K19(2.856,3.036) K27(8.056,3.035) K28(8.706,3.036) L1(-8.844,2.385) L2(-8.194,2.385) L3(-7.544,2.385) L4(-6.894,2.385) L5(-6.244,2.385) L6(-5.594,2.385) L7(-4.944,2.385) L8(-4.294,2.385) L9(-3.644,2.385) L10(-2.994,2.385) L11(-2.344,2.385) L12(-1.694,2.385) L13(-1.044,2.385) L14(-0.395,2.385) L15(0.256,2.385) L16(0.906,2.385) L17(1.556,2.385) L18(2.206,2.385) L19(2.856,2.385) L20(3.506,2.385) L21(4.156,2.385) L22(4.806,2.385) L23(5.456,2.385) L24(6.106,2.385) L25(6.756,2.385) L26(7.406,2.385) L27(8.056,2.385) L28(8.706,2.385) M1(-8.844,1.736) M2(-8.194,1.736) M3(-7.544,1.736) M4(-6.894,1.736) M5(-6.244,1.736) M6(-5.594,1.736) M7(-4.944,1.736) M8(-4.294,1.736) M9(-3.644,1.736) M10(-2.994,1.736) M11(-2.344,1.736) M12(-1.694,1.736) M13(-1.044,1.736) M14(-0.394,1.736) M15(0.256,1.736) M16(0.906,1.736) M17(1.556,1.736) M18(2.206,1.736) M19(2.856,1.736) M20(3.506,1.736) M21(4.156,1.736) M22(4.806,1.736) M23(5.456,1.736) M24(6.106,1.736) M25(6.756,1.736) M26(7.406,1.736) M27(8.056,1.736) M28(8.706,1.736) N1(-8.844,1.085) N2(-8.194,1.085) N10(-2.994,1.085) N11(-2.344,1.085) N12(-1.694,1.085) N13(-1.044,1.085) N14(-0.395,1.085) N15(0.256,1.085) N16(0.906,1.085) N17(1.556,1.085) N18(2.206,1.085) N19(2.856,1.085) N27(8.056,1.085) N28(8.706,1.085) P1(-8.844,0.435) P2(-8.194,0.435) P3(-7.544,0.435) P4(-6.894,0.435) P5(-6.244,0.435) P6(-5.594,0.435) P7(-4.944,0.435) P8(-4.294,0.435) P9(-3.644,0.435) P10(-2.994,0.435) P11(-2.344,0.435) P12(-1.694,0.435) P13(-1.044,0.435) P14(-0.394,0.435) P15(0.256,0.435) P16(0.906,0.435) P17(1.556,0.435) P18(2.206,0.435) P19(2.856,0.435) P20(3.506,0.435) P21(4.156,0.435) P22(4.806,0.435) P23(5.456,0.435) P24(6.106,0.435) P25(6.756,0.435) P26(7.406,0.435) P27(8.056,0.435) P28(8.706,0.435) R1(-8.844,-0.215) R2(-8.194,-0.214) R3(-7.544,-0.215) R4(-6.894,-0.214) R5(-6.244,-0.215) R6(-5.594,-0.214) R7(-4.944,-0.215) R8(-4.294,-0.214) R9(-3.644,-0.215) R10(-2.994,-0.214) R11(-2.344,-0.215) R12(-1.694,-0.214) R13(-1.044,-0.215) R14(-0.394,-0.214) R15(0.256,-0.214) R16(0.906,-0.215) R17(1.556,-0.214) R18(2.206,-0.215) R19(2.856,-0.214) R20(3.506,-0.215) R21(4.156,-0.214) R22(4.806,-0.215) R23(5.456,-0.214) R24(6.106,-0.215) R25(6.756,-0.214) R26(7.406,-0.215) R27(8.056,-0.214) R28(8.706,-0.215) T1(-8.844,-0.865) T2(-8.194,-0.865) T10(-2.994,-0.865) T11(-2.344,-0.865) T12(-1.694,-0.865) T13(-1.044,-0.865) T14(-0.395,-0.865) T15(0.256,-0.865) T16(0.906,-0.865) T17(1.556,-0.865) T18(2.206,-0.865) T19(2.856,-0.865) T27(8.056,-0.865) T28(8.706,-0.865) U1(-8.844,-1.514) U2(-8.194,-1.514) U3(-7.544,-1.515) U4(-6.894,-1.514) U5(-6.244,-1.515) U6(-5.594,-1.514) U7(-4.944,-1.515) U8(-4.294,-1.514) U9(-3.644,-1.515) U10(-2.994,-1.514) U11(-2.344,-1.515) U12(-1.694,-1.514) U13(-1.044,-1.514) U14(-0.394,-1.514) U15(0.256,-1.514) U16(0.906,-1.514) U17(1.556,-1.514) U18(2.206,-1.515) U19(2.856,-1.514) U20(3.506,-1.515) U21(4.156,-1.514) U22(4.806,-1.515) U23(5.456,-1.514) U24(6.106,-1.515) U25(6.756,-1.514) U26(7.406,-1.515) U27(8.056,-1.514) U28(8.706,-1.514) V1(-8.844,-2.164) V2(-8.194,-2.165) V3(-7.544,-2.164) V4(-6.894,-2.165) V5(-6.244,-2.164) V6(-5.594,-2.165) V7(-4.944,-2.165) V8(-4.294,-2.165) V9(-3.644,-2.165) V10(-2.994,-2.165) V11(-2.344,-2.164) V12(-1.694,-2.164) V13(-1.044,-2.164) V14(-0.395,-2.164) V15(0.256,-2.164) V16(0.906,-2.164) V17(1.556,-2.164) V18(2.206,-2.164) V19(2.856,-2.165) V20(3.506,-2.164) V21(4.156,-2.165) V22(4.806,-2.164) V23(5.456,-2.165) V24(6.106,-2.165) V25(6.756,-2.165) V26(7.406,-2.164) V27(8.056,-2.164) V28(8.706,-2.164) W1(-8.844,-2.814) W2(-8.194,-2.814) W10(-2.994,-2.814) W11(-2.345,-2.814) W12(-1.694,-2.814) W13(-1.044,-2.814) W14(-0.394,-2.814) W15(0.256,-2.814) W16(0.906,-2.814) W17(1.556,-2.814) W18(2.206,-2.814) W19(2.856,-2.814) W27(8.056,-2.814) W28(8.706,-2.814) Y1(-8.844,-3.465) Y2(-8.194,-3.464) Y3(-7.544,-3.465) Y4(-6.894,-3.465) Y5(-6.244,-3.465) Y6(-5.594,-3.465) Y7(-4.944,-3.465) Y8(-4.294,-3.465) Y9(-3.644,-3.465) Y11(-2.344,-3.465) Y12(-1.694,-3.465) Y14(-0.395,-3.465) Y15(0.256,-3.465) Y17(1.556,-3.465) Y18(2.206,-3.465) Y20(3.506,-3.465) Y21(4.156,-3.465) Y22(4.806,-3.465) Y23(5.456,-3.465) Y24(6.106,-3.464) Y25(6.755,-3.465) Y26(7.406,-3.465) Y27(8.056,-3.465) Y28(8.706,-3.465)
C0201
  rect 0.368x0.324 smd: 1(-0.275,0) 2(0.275,0)
C0402
  rect 0.566x0.54 smd: 1(-0.433,0) 2(0.433,0)
c0402-nsk
  rect 0.559x0.559 smd: 1(-0.508,0) 2(0.508,0)
C0402_1
  rect 0.5x0.54 smd: 1(-0.42,0) 2(0.42,0)
C0603
  rect 0.8x0.9 smd: 1(-0.7,0) 2(0.7,0)
c0603-nsk
  rect 0.85x0.85 smd: 1(-0.75,0) 2(0.75,0)
C0603_2
  rect 0.8x0.9 smd: 1(-0.7,0) 2(0.7,0)
C0603_3
  rect 0.8x0.9 smd: 1(-0.7,0) 2(0.7,0)
CONN-SMD_120P-P0.40_DF40C-120DP-0.4V-51
  rect 0.2x0.66 smd: 1(-11.8,-1.355) 2(-11.8,1.355) 3(-11.4,-1.355) 4(-11.4,1.355) 5(-11,-1.355) 6(-11,1.355) 7(-10.6,-1.355) 8(-10.6,1.355) 9(-10.2,-1.355) 10(-10.2,1.355) 11(-9.8,-1.355) 12(-9.8,1.355) 13(-9.4,-1.355) 14(-9.4,1.355) 15(-9,-1.355) 16(-9,1.355) 17(-8.6,-1.355) 18(-8.6,1.355) 19(-8.2,-1.355) 20(-8.2,1.355) 21(-7.8,-1.355) 22(-7.8,1.355) 23(-7.4,-1.355) 24(-7.4,1.355) 25(-7,-1.355) 26(-7,1.355) 27(-6.6,-1.355) 28(-6.6,1.355) 29(-6.2,-1.355) 30(-6.2,1.355) 31(-5.8,-1.355) 32(-5.8,1.355) 33(-5.4,-1.355) 34(-5.4,1.355) 35(-5,-1.355) 36(-5,1.355) 37(-4.6,-1.355) 38(-4.6,1.355) 39(-4.2,-1.355) 40(-4.2,1.355) 41(-3.8,-1.355) 42(-3.8,1.355) 43(-3.4,-1.355) 44(-3.4,1.355) 45(-3,-1.355) 46(-3,1.355) 47(-2.6,-1.355) 48(-2.6,1.355) 49(-2.2,-1.355) 50(-2.2,1.355) 51(-1.8,-1.355) 52(-1.8,1.355) 53(-1.4,-1.355) 54(-1.4,1.355) 55(-1,-1.355) 56(-1,1.355) 57(-0.6,-1.355) 58(-0.6,1.355) 59(-0.2,-1.355) 60(-0.2,1.355) 61(0.2,-1.355) 62(0.2,1.355) 63(0.6,-1.355) 64(0.6,1.355) 65(1,-1.355) 66(1,1.355) 67(1.4,-1.355) 68(1.4,1.355) 69(1.8,-1.355) 70(1.8,1.355) 71(2.2,-1.355) 72(2.2,1.355) 73(2.6,-1.355) 74(2.6,1.355) 75(3,-1.355) 76(3,1.355) 77(3.4,-1.355) 78(3.4,1.355) 79(3.8,-1.355) 80(3.8,1.355) 81(4.2,-1.355) 82(4.2,1.355) 83(4.6,-1.355) 84(4.6,1.355) 85(5,-1.355) 86(5,1.355) 87(5.4,-1.355) 88(5.4,1.355) 89(5.8,-1.355) 90(5.8,1.355) 91(6.2,-1.355) 92(6.2,1.355) 93(6.6,-1.355) 94(6.6,1.355) 95(7,-1.355) 96(7,1.355) 97(7.4,-1.355) 98(7.4,1.355) 99(7.8,-1.355) 100(7.8,1.355) 101(8.2,-1.355) 102(8.2,1.355) 103(8.6,-1.355) 104(8.6,1.355) 105(9,-1.355) 106(9,1.355) 107(9.4,-1.355) 108(9.4,1.355) 109(9.8,-1.355) 110(9.8,1.355) 111(10.2,-1.355) 112(10.2,1.355) 113(10.6,-1.355) 114(10.6,1.355) 115(11,-1.355) 116(11,1.355) 117(11.4,-1.355) 118(11.4,1.355) 119(11.8,-1.355) 120(11.8,1.355)
  rect 0.3x0.66 smd: 121(12.265,-1.355) 122(12.265,1.355) 123(-12.265,-1.355) 124(-12.265,1.355)
CRYSTAL-SMD_4P-L3.2-W2.5-BL
  rect 1.4x1.2 smd: 1(-1.1,-0.85) 2(1.1,-0.85) 3(1.1,0.85) 4(-1.1,0.85)
CRYSTAL-SMD_4P-L3.2-W2.5-BL_1
  rect 1.4x1.2 smd: 1(-1.1,-0.85) 2(1.1,-0.85) 3(1.1,0.85) 4(-1.1,0.85)
CRYSTAL-SMD_L3.2-W1.5-1
  rect 1.05x1.7 smd: 1(-1.275,0) 2(1.275,0)
fbga-153_l13.0-w11.5-p0.50_klmag1jetd-b041
  oval 0.203x0.305 smd: A1(-3.25,3.25) A2(-2.75,3.25) A3(-2.25,3.25) A4(-1.75,3.25) A5(-1.25,3.25) A6(-0.75,3.25) A7(-0.25,3.25) P1(-3.25,-3.25) P2(-2.75,-3.25)
  round 0.25 smd: A8(0.25,3.25) A9(0.75,3.25) A10(1.25,3.25) A11(1.75,3.25) A12(2.25,3.25) A13(2.75,3.25) A14(3.25,3.25) B1(-3.25,2.75) B2(-2.75,2.75) B3(-2.25,2.75) B4(-1.75,2.75) B5(-1.25,2.75) B6(-0.75,2.75) B7(-0.25,2.75) B8(0.25,2.75) B9(0.75,2.75) B10(1.25,2.75) B11(1.75,2.75) B12(2.25,2.75) B13(2.75,2.75) B14(3.25,2.75) C2(-2.75,2.25) C3(-2.25,2.25) C4(-1.75,2.25) C5(-1.25,2.25) C6(-0.75,2.25) C7(-0.25,2.25) C8(0.25,2.25) C9(0.75,2.25) C10(1.25,2.25) C11(1.75,2.25) C12(2.25,2.25) C13(2.75,2.25) C14(3.25,2.25) D2(-2.75,1.75) D3(-2.25,1.75) D4(-1.75,1.75) D12(2.25,1.75) D13(2.75,1.75) D14(3.25,1.75) E1(-3.25,1.25) E2(-2.75,1.25) E3(-2.25,1.25) E5(-1.25,1.25) E6(-0.75,1.25) E7(-0.25,1.25) E8(0.25,1.25) E9(0.75,1.25) E10(1.25,1.25) E12(2.25,1.25) E13(2.75,1.25) E14(3.25,1.25) F1(-3.25,0.75) F2(-2.75,0.75) F3(-2.25,0.75) F5(-1.25,0.75) F10(1.25,0.75) F12(2.25,0.75) F13(2.75,0.75) F14(3.25,0.75) G1(-3.25,0.25) G2(-2.75,0.25) G3(-2.25,0.25) G5(-1.25,0.25) G10(1.25,0.25) G12(2.25,0.25) G13(2.75,0.25) G14(3.25,0.25) H1(-3.25,-0.25) H2(-2.75,-0.25) H3(-2.25,-0.25) H5(-1.25,-0.25) H10(1.25,-0.25) H12(2.25,-0.25) H13(2.75,-0.25) H14(3.25,-0.25) J1(-3.25,-0.75) J2(-2.75,-0.75) J3(-2.25,-0.75) J5(-1.25,-0.75) J10(1.25,-0.75) J12(2.25,-0.75) J13(2.75,-0.75) J14(3.25,-0.75) K1(-3.25,-1.25) K2(-2.75,-1.25) K3(-2.25,-1.25) K5(-1.25,-1.25) K6(-0.75,-1.25) K7(-0.25,-1.25) K8(0.25,-1.25) K9(0.75,-1.25) K10(1.25,-1.25) K12(2.25,-1.25) K13(2.75,-1.25) K14(3.25,-1.25) L1(-3.25,-1.75) L2(-2.75,-1.75) L3(-2.25,-1.75) L12(2.25,-1.75) L13(2.75,-1.75) L14(3.25,-1.75) M1(-3.25,-2.25) M2(-2.75,-2.25) M3(-2.25,-2.25) M4(-1.75,-2.25) M5(-1.25,-2.25) M6(-0.75,-2.25) M7(-0.25,-2.25) M8(0.25,-2.25) M9(0.75,-2.25) M10(1.25,-2.25) M11(1.75,-2.25) M12(2.25,-2.25) M13(2.75,-2.25) M14(3.25,-2.25) N1(-3.25,-2.75) N2(-2.75,-2.75) N3(-2.25,-2.75) N4(-1.75,-2.75) N5(-1.25,-2.75) N6(-0.75,-2.75) N7(-0.25,-2.75) N8(0.25,-2.75) N9(0.75,-2.75) N10(1.25,-2.75) N11(1.75,-2.75) N12(2.25,-2.75) N13(2.75,-2.75) N14(3.25,-2.75) P3(-2.25,-3.25) P4(-1.75,-3.25) P5(-1.25,-3.25) P6(-0.75,-3.25) P7(-0.25,-3.25) P8(0.25,-3.25) P9(0.75,-3.25) P10(1.25,-3.25) P11(1.75,-3.25) P12(2.25,-3.25) P13(2.75,-3.25) P14(3.25,-3.25)
  oval 0.305x0.203 smd: C1(-3.25,2.25) D1(-3.25,1.75)
HDR-TH_3P-P2.54-V-M_1
  rect 1.7x1.7 hole 1.1: 1(-2.54,0)
  round 1.7 hole 1.1: 2(0,0) 3(2.54,0)
IND-SMD_L2.0-W1.6_MHCHL201610A-1R0M-Q8A
  rect 0.8x2 smd: 1(-0.9,0) 2(0.9,0)
IND-SMD_L2.5-W2.0_WPN252012H
  rect 1.724x1.87 smd: 1(1.228,0) 2(-1.228,0)
IND-SMD_L3.0-W3.0
  rect 1.5x3.32 smd: 1(1.328,0) 2(-1.328,0)
IND-SMD_L4.4-W4.2
  rect 1.4x2.12 smd: 1(2.028,0) 2(-2.028,0)
L0402
  rect 0.79x0.54 smd: 1(-0.545,0) 2(0.545,0)
L0603
  rect 0.8x0.864 smd: 1(-0.7,0) 2(0.7,0)
L0603_1
  rect 0.8x0.864 smd: 1(-0.7,0) 2(0.7,0)
LED_0603
  rect 0.8x0.8 smd: 1(-0.851,-0.01) 2(0.75,-0.005)
LPDDR4_MrX
  round 0.27 smd: A1(-4.4,6.825) A2(-3.6,6.825) A3(-2.8,6.825) A4(-2,6.825) A5(-1.2,6.825) A8(1.2,6.825) A9(2,6.825) A10(2.8,6.825) A11(3.6,6.825) A12(4.4,6.825) AA1(-4.4,-6.175) AA2(-3.6,-6.175) AA3(-2.8,-6.175) AA4(-2,-6.175) AA5(-1.2,-6.175) AA8(1.2,-6.175) AA9(2,-6.175) AA10(2.8,-6.175) AA11(3.6,-6.175) AA12(4.4,-6.175) AB1(-4.4,-6.825) AB2(-3.6,-6.825) AB3(-2.8,-6.825) AB4(-2,-6.825) AB5(-1.2,-6.825) AB8(1.2,-6.825) AB9(2,-6.825) AB10(2.8,-6.825) AB11(3.6,-6.825) AB12(4.4,-6.825) B1(-4.4,6.175) B2(-3.6,6.175) B3(-2.8,6.175) B4(-2,6.175) B5(-1.2,6.175) B8(1.2,6.175) B9(2,6.175) B10(2.8,6.175) B11(3.6,6.175) B12(4.4,6.175) C1(-4.4,5.525) C2(-3.6,5.525) C3(-2.8,5.525) C4(-2,5.525) C5(-1.2,5.525) C8(1.2,5.525) C9(2,5.525) C10(2.8,5.525) C11(3.6,5.525) C12(4.4,5.525) D1(-4.4,4.875) D2(-3.6,4.875) D3(-2.8,4.875) D4(-2,4.875) D5(-1.2,4.875) D8(1.2,4.875) D9(2,4.875) D10(2.8,4.875) D11(3.6,4.875) D12(4.4,4.875) E1(-4.4,4.225) E2(-3.6,4.225) E3(-2.8,4.225) E4(-2,4.225) E5(-1.2,4.225) E8(1.2,4.225) E9(2,4.225) E10(2.8,4.225) E11(3.6,4.225) E12(4.4,4.225) F1(-4.4,3.575) F2(-3.6,3.575) F3(-2.8,3.575) F4(-2,3.575) F5(-1.2,3.575) F8(1.2,3.575) F9(2,3.575) F10(2.8,3.575) F11(3.6,3.575) F12(4.4,3.575) G1(-4.4,2.925) G2(-3.6,2.925) G3(-2.8,2.925) G4(-2,2.925) G5(-1.2,2.925) G8(1.2,2.925) G9(2,2.925) G10(2.8,2.925) G11(3.6,2.925) G12(4.4,2.925) H1(-4.4,2.275) H2(-3.6,2.275) H3(-2.8,2.275) H4(-2,2.275) H5(-1.2,2.275) H8(1.2,2.275) H9(2,2.275) H10(2.8,2.275) H11(3.6,2.275) H12(4.4,2.275) J1(-4.4,1.625) J2(-3.6,1.625) J3(-2.8,1.625) J4(-2,1.625) J5(-1.2,1.625) J8(1.2,1.625) J9(2,1.625) J10(2.8,1.625) J11(3.6,1.625) J12(4.4,1.625) K1(-4.4,0.975) K2(-3.6,0.975) K3(-2.8,0.975) K4(-2,0.975) K5(-1.2,0.975) K8(1.2,0.975) K9(2,0.975) K10(2.8,0.975) K11(3.6,0.975) K12(4.4,0.975) N1(-4.4,-0.975) N2(-3.6,-0.975) N3(-2.8,-0.975) N4(-2,-0.975) N5(-1.2,-0.975) N8(1.2,-0.975) N9(2,-0.975) N10(2.8,-0.975) N11(3.6,-0.975) N12(4.4,-0.975) P1(-4.4,-1.625) P2(-3.6,-1.625) P3(-2.8,-1.625) P4(-2,-1.625) P5(-1.2,-1.625) P8(1.2,-1.625) P9(2,-1.625) P10(2.8,-1.625) P11(3.6,-1.625) P12(4.4,-1.625) R1(-4.4,-2.275) R2(-3.6,-2.275) R3(-2.8,-2.275) R4(-2,-2.275) R5(-1.2,-2.275) R8(1.2,-2.275) R9(2,-2.275) R10(2.8,-2.275) R11(3.6,-2.275) R12(4.4,-2.275) T1(-4.4,-2.925) T2(-3.6,-2.925) T3(-2.8,-2.925) T4(-2,-2.925) T5(-1.2,-2.925) T8(1.2,-2.925) T9(2,-2.925) T10(2.8,-2.925) T11(3.6,-2.925) T12(4.4,-2.925) U1(-4.4,-3.575) U2(-3.6,-3.575) U3(-2.8,-3.575) U4(-2,-3.575) U5(-1.2,-3.575) U8(1.2,-3.575) U9(2,-3.575) U10(2.8,-3.575) U11(3.6,-3.575) U12(4.4,-3.575) V1(-4.4,-4.225) V2(-3.6,-4.225) V3(-2.8,-4.225) V4(-2,-4.225) V5(-1.2,-4.225) V8(1.2,-4.225) V9(2,-4.225) V10(2.8,-4.225) V11(3.6,-4.225) V12(4.4,-4.225) W1(-4.4,-4.875) W2(-3.6,-4.875) W3(-2.8,-4.875) W4(-2,-4.875) W5(-1.2,-4.875) W8(1.2,-4.875) W9(2,-4.875) W10(2.8,-4.875) W11(3.6,-4.875) W12(4.4,-4.875) Y1(-4.4,-5.525) Y2(-3.6,-5.525) Y3(-2.8,-5.525) Y4(-2,-5.525) Y5(-1.2,-5.525) Y8(1.2,-5.525) Y9(2,-5.525) Y10(2.8,-5.525) Y11(3.6,-5.525) Y12(4.4,-5.525)
LQFP-64_L10.0-W10.0-P0.50-LS12.0-BL_1
  oval 0.3x1.5 smd: 1(-3.75,-5.688) 2(-3.25,-5.688) 3(-2.75,-5.688) 4(-2.25,-5.688) 5(-1.75,-5.688) 6(-1.25,-5.688) 7(-0.75,-5.688) 8(-0.25,-5.688) 9(0.25,-5.688) 10(0.75,-5.688) 11(1.25,-5.688) 12(1.75,-5.688) 13(2.25,-5.688) 14(2.75,-5.688) 15(3.25,-5.688) 16(3.75,-5.688) 33(3.75,5.688) 34(3.25,5.688) 35(2.75,5.688) 36(2.25,5.688) 37(1.75,5.688) 38(1.25,5.688) 39(0.75,5.688) 40(0.25,5.688) 41(-0.25,5.688) 42(-0.75,5.688) 43(-1.25,5.688) 44(-1.75,5.688) 45(-2.25,5.688) 46(-2.75,5.688) 47(-3.25,5.688) 48(-3.75,5.688)
  oval 1.5x0.3 smd: 17(5.7,-3.738) 18(5.7,-3.238) 19(5.7,-2.738) 20(5.7,-2.238) 21(5.7,-1.738) 22(5.7,-1.238) 23(5.7,-0.739) 24(5.7,-0.238) 25(5.7,0.262) 26(5.7,0.762) 27(5.7,1.262) 28(5.7,1.762) 29(5.7,2.261) 30(5.7,2.762) 31(5.7,3.261) 32(5.7,3.762) 49(-5.7,3.762) 50(-5.7,3.261) 51(-5.7,2.762) 52(-5.7,2.261) 53(-5.7,1.762) 54(-5.7,1.262) 55(-5.7,0.762) 56(-5.7,0.262) 57(-5.7,-0.238) 58(-5.7,-0.739) 59(-5.7,-1.238) 60(-5.7,-1.738) 61(-5.7,-2.238) 62(-5.7,-2.738) 63(-5.7,-3.238) 64(-5.7,-3.738)
R0201
  rect 0.303x0.324 smd: 1(-0.241,0) 2(0.241,0)
R0402
  rect 0.566x0.54 smd: 1(-0.433,0) 2(0.433,0)
r0402-nsk
  rect 0.5x0.559 smd: 1(-0.457,0) 2(0.457,0)
R0402_1
  rect 0.566x0.54 smd: 1(-0.433,0) 2(0.433,0)
R0402_2
  rect 0.566x0.54 smd: 1(-0.433,0) 2(0.433,0)
R0402_3
  rect 0.566x0.54 smd: 1(-0.433,0) 2(0.433,0)
R0402_4
  rect 0.566x0.54 smd: 1(-0.433,0) 2(0.433,0)
R0603
  rect 0.806x0.864 smd: 1(-0.753,0) 2(0.753,0)
R0603_1
  rect 0.806x0.864 smd: 1(-0.753,0) 2(0.753,0)
R0603_2
  rect 0.806x0.864 smd: 1(-0.753,0) 2(0.753,0)
RK809-5
  oval 0.74x0.15 smd: 1(-3.534,2.419) 2(-3.534,2.069) 3(-3.534,1.719) 4(-3.534,1.369) 5(-3.534,1.019) 6(-3.534,0.669) 7(-3.534,0.319) 8(-3.534,-0.031) 9(-3.534,-0.381) 10(-3.534,-0.731) 11(-3.534,-1.081) 12(-3.534,-1.431) 13(-3.534,-1.781) 14(-3.534,-2.131) 15(-3.534,-2.481) 16(-3.534,-2.831) 17(-3.534,-3.181) 35(3.28,-3.181) 36(3.28,-2.831) 37(3.28,-2.481) 38(3.28,-2.131) 39(3.28,-1.781) 40(3.28,-1.431) 41(3.28,-1.081) 42(3.28,-0.731) 43(3.28,-0.381) 44(3.28,-0.031) 45(3.28,0.319) 46(3.28,0.669) 47(3.28,1.019) 48(3.28,1.369) 49(3.28,1.719) 50(3.28,2.069) 51(3.28,2.419)
  oval 0.15x0.74 smd: 18(-2.927,-3.788) 19(-2.577,-3.788) 20(-2.227,-3.788) 21(-1.877,-3.788) 22(-1.527,-3.788) 23(-1.177,-3.788) 24(-0.827,-3.788) 25(-0.477,-3.788) 26(-0.127,-3.788) 27(0.223,-3.788) 28(0.573,-3.788) 29(0.923,-3.788) 30(1.273,-3.788) 31(1.623,-3.788) 32(1.973,-3.788) 33(2.323,-3.788) 34(2.673,-3.788) 52(2.673,3.026) 53(2.323,3.026) 54(1.973,3.026) 55(1.623,3.026) 56(1.273,3.026) 57(0.923,3.026) 58(0.573,3.026) 59(0.223,3.026) 60(-0.127,3.026) 61(-0.477,3.026) 62(-0.827,3.026) 63(-1.177,3.026) 64(-1.527,3.026) 65(-1.877,3.026) 66(-2.227,3.026) 67(-2.577,3.026) 68(-2.927,3.026)
  rect 5.5x5.5 smd: 69(-0.127,-0.381)
SOD-123FL_L2.8-W1.7-LS3.6-RD
  rect 0.93x0.96 smd: 1(-1.585,0) 2(1.585,0)
SOT-23-5_L3.0-W1.7-P0.95-LS2.8-BR
  rect 1x0.6 smd: 1(1.3,-0.95) 2(1.3,0) 3(1.3,0.95) 4(-1.3,0.95) 5(-1.3,-0.95)
TCS4525
  round 0.265 smd: A1(0,0) A2(0.4,0) A3(0.8,0) A4(1.2,0) B1(0,-0.4) B2(0.4,-0.4) B3(0.8,-0.4) B4(1.2,-0.4) C1(0,-0.8) C2(0.4,-0.8) C3(0.8,-0.8) C4(1.2,-0.8) D1(0,-1.2) D2(0.4,-1.2) D3(0.8,-1.2) D4(1.2,-1.2) E1(0,-1.6) E2(0.4,-1.6) E3(0.8,-1.6) E4(1.2,-1.6)
Test-Point-0.5mm
  round 0.5 smd: 1(0,0)
Test-Point-0.5mm_1
  round 0.5 smd: 1(0,0)
TSOT-23-6_L2.9-W1.6-P0.95-LS2.8-BR
  rect 0.8x0.532 smd: 1(1.2,-0.95) 2(1.2,0) 3(1.2,0.95) 4(-1.2,0.95) 5(-1.2,0) 6(-1.2,-0.95)
USB-C_SMD-TYPE-C-31-M-12
  oval 1.2x2 hole 0.8x1.6: 0(-4.325,1.706) 1(4.325,1.706)
  oval 1.2x1.8 hole 0.8x1.4: 2(4.325,-2.474) 3(-4.325,-2.474)
  rect 0.3x1.3 smd: A1(-3.35,2.474) A4(-2.55,2.474) A5(-1.25,2.474) A6(-0.25,2.474) A7(0.25,2.474) A8(1.25,2.474) A9(2.55,2.474) A12(3.35,2.474) B1(3.05,2.474) B4(2.25,2.474) B5(1.75,2.474) B6(0.75,2.474) B7(-0.75,2.474) B8(-1.75,2.474) B9(-2.25,2.474) B12(-3.05,2.474)

## Nets
As in the schematic, except:
RESETN: C21.2 C127.2 R2.2 R63.2 R64.2 U4.AH27 U5.67

Pads without a net: CN4 123 124; CN5 96 98 100 102 104 106 108 109 110 111 112 113 114 115 116 117 118 119 120 121 122 123 124; U3 A1 A2 A7 A8 A9 A10 A11 A12 A13 A14 B1 B7 B8 B9 B10 B11 B12 B13 B14 C1 C3 C5 C7 C8 C9 C10 C11 C12 C13 C14 D1 D2 D3 D4 D12 D13 D14 E1 E2 E3 E5 E8 E9 E10 E12 E13 E14 F1 F2 F3 F10 F12 F13 F14 G1 G2 G3 G10 G12 G13 G14 H1 H2 H3 H12 H13 H14 J1 J2 J3 J12 J13 J14 K1 K2 K3 K6 K7 K10 K12 K13 K14 L1 L2 L3 L12 L13 L14 M1 M2 M3 M7 M8 M9 M10 M11 M12 M13 M14 N1 N3 N6 N7 N8 N9 N10 N11 N12 N13 N14 P1 P2 P7 P8 P9 P10 P11 P12 P13 P14; U4 A22 A27 AC14 AC17 AD12 AD14 AD15 AD17 AD18 AE12 AE15 AE18 C23 C24 C26 D23 D24 D26 E23 E25 F5 F7 F8 F21 F22 G20 G21 J28 K27 K28 L25 L27 L28 M4 M5 M7 M25 M27 M28 N27 P1 P2 P4 P5 P7 P8 R4 R5 R7 R24 R25 U24 U25; U5 60; U6 A1 A2 A11 A12 AA1 AA12 AB1 AB2 AB11 AB12 B1 B12 G11 K5 K8 N5 N8; USBC1 A8 B8

## Via types
v1: diameter 0.399, hole 0.299, Top Layer to Bottom Layer, 982 vias

## Routing (per net, layer and track width the routed paths; a pad name or vN(x,y) marks a point on that pad's centre or on a via; arc(x,y) is an arc through that point)
GND: length 679.4
  Top Layer w0.102: U6.E1 31.73,40.98 31.67,40.91 31.67,40.27 v1(31.61,40.22) ; U3.N2 55.88,49.1 55.88,49.67 55.95,49.74 56.38,49.74 56.48,49.64 v1(56.53,49.64) ; 32.52,35.24 32.56,35.2 34.09,35.2 34.1,35.19 ; v1(37.66,36.81) 37.66,36.91 35.73,38.84 35.73,42.98 34.76,43.95 v1(34.58,43.95) ; 31.75,33.56 32.23,33.08
  Top Layer w0.152: 10,40.23 9.65,39.89 9.65,39.86 9.63,39.84 9.63,39.44 ; C126.1 9.83,38.62 9.63,38.83 9.63,39.44 ; 9.63,39.44 9.2,39.44 8.45,40.19 R58.2 ; 5.87,44.51 7.88,44.51 7.88,42.51 ; C119.1 13.34,54.23 13.78,53.79 13.78,53.09 12.89,52.21 C77.2 ; 9.28,45.91 v1(8.82,45.45) 8.28,44.91 ; v1(33.04,27.33) 32.59,27.79
  Top Layer w0.203: v1(53.29,42.17) 53.65,42.53 53.65,42.86 ; 38.94,40.42 38.94,41.09 U6.T1 ; U4.F1 34.11,34.09 34.11,33.64 34.45,33.3 34.87,33.3 34.88,33.32 ; U6.G1 33.03,38.99 v1(33.19,38.83) ; 37.33,39.68 37.53,39.88 37.53,41.1 37.58,41.15
  Top Layer w0.254: U4.AB15 32.6,20.45 v1(32.6,20.45) ; U4.AB15 v1(33.05,19.99) ; U4.AB15 33.07,20.47 33.07,20.91 ; U4.AB15 v1(33.5,20.45) ; U6.AB10 v1(43.16,48.73) ; 37.18,14.47 37.64,14.47 U4.AC26 v1(37.64,15.39) ; 37.18,14.47 v1(37.18,14.93) 37.18,15.39 ; 37.18,14.47 37.18,13.55 ; 33.07,20.91 v1(33.05,20.93) 33.05,21.37 ; 33.07,20.91 U4.AB14 ; 33.07,20.91 U4.AA15 v1(33.5,20.45) ; 33.5,25.04 33.5,25.5 ; 33.5,25.04 U4.U10 ; 33.5,25.04 U4.T11 ; 33.5,25.5 33.09,25.5 ; 33.5,25.5 33.92,25.5 33.96,25.47 ; U4.AF15 30.76,18.61 30.75,18.63 U4.AF14 ; U4.AF15 31.21,19.1 30.78,19.1 U4.AF14 ; U4.AF15 31.53,18.28 v1(31.67,18.28) ; 40.91,25 40.97,25 v1(41.33,24.64) 41.26,24.64 40.91,24.99 ; 40.91,25 41,25.1 41.53,25.1 41.78,25.34 41.78,25.78 41.98,25.99 41.35,25.99 41.32,25.96 v1(41.32,26.42) ; 40.91,25 40.91,24.99 ; v1(28.69,42.66) 28.79,42.75 U6.A3 ; 36.68,24.58 36.72,24.54 U4.P15 ; 36.68,24.58 36.72,24.63 36.72,25.96 ; 36.68,24.58 U4.P14 36.26,24.14 ; 36.68,24.58 37.18,24.58 ; 32.59,31.02 32.32,31.02 32.13,30.83 U4.M3 32.13,29.92 ; C9.1 v1(21.01,48.87) v1(20.23,48.87) v1(19.08,48.87) C84.2 ; v1(38.1,26.88) U4.K14 v1(37.64,26.42) ; v1(38.1,26.88) U4.K13 ; v1(38.1,26.88) 38.04,26.94 38.04,27.32 37.67,27.32 v1(37.64,27.34) ; 38.78,28.98 39.01,28.75 v1(39.26,28.75) 39.45,28.75 39.94,28.26 ; 38.78,28.98 38.98,29.18 U4.F12 ; 38.78,28.98 38.56,28.76 ; 38.78,28.98 38.77,28.98 38.57,29.18 U4.G11 38.09,29.17 v1(37.65,29.17) ; v1(41.32,26.42) U4.F17 v1(41.78,26.88) ; v1(41.32,26.42) U4.G17 39.91,26.42 39.94,26.39 39.94,25.5 40.4,25.5 U4.J18 40.45,24.99 40.91,24.99 ; C119.1 13.1,54.55 13.1,54.97 13.05,55.02 v1(12.1,55.02) ; U6.AB5 v1(43.16,43.97) ; U4.V15 34.88,21.83 ; U4.V15 34.89,22.29 v1(34.89,22.68) ; U4.V15 34.43,22.29 34.43,22.74 U4.V14 ; U4.L20 40.4,23.62 40.35,23.66 ; U4.L20 40.4,22.75 ; U4.L20 40.35,23.16 ; 37.64,21.83 U4.R19 38.1,21.37 37.18,21.37 37.18,21.83 ; 37.64,21.83 U4.T19 ; 37.64,21.83 37.18,21.83 ; 37.64,21.83 U4.R18 ; v1(37.64,15.39) 38.56,15.39 U4.AA26 v1(39.02,15.85) 39.02,16.31 ; v1(37.64,15.39) 37.61,15.39 ; v1(37.64,15.39) 37.64,15.43 ; C130.1 v1(21.29,12.08) 21.29,11.63 21.97,10.96 22.3,10.96 C131.1 ; 36.72,27.8 36.72,27.81 v1(36.28,27.81) 36.28,27.36 ; 31.7,25.04 31.23,25.04 31.21,25.02 ; 31.7,25.04 U4.U10 ; 31.7,25.04 31.7,25.47 31.67,25.5 v1(31.21,25.5) 31.21,25.02 ; 30.75,31.02 30.74,31.02 v1(30.36,31.4) 30.35,31.41 29.65,31.41 ; v1(36.72,21.83) U4.U17 v1(35.8,21.83) ; v1(36.72,21.83) 36.72,21.37 37.18,21.37 ; v1(36.72,21.83) 37.18,21.83 ; v1(36.72,21.83) 36.72,22.29 ; U4.AH1 23.54,24.12 23.18,24.48 v1(23.18,25.11) ; U3.N5 54.12,48.86 53.63,49.34 U3.P6 53.6,49.4 v1(53.6,49.92) ; U26.2 13.73,7.8 v1(13.73,7.09) ; U4.C6 37.63,33.31 37.63,32.8 37.18,32.35 ; U4.AB17 34.42,19.53 U4.AA17 v1(33.97,19.99) ; U4.AB17 U4.AC18 v1(33.97,18.15) ; U4.AB17 v1(33.51,19.53) ; U4.AB17 33.97,19.99 v1(33.97,19.99) ; U6.V5 40.33,44.2 ; 40.33,44.2 40.29,44.16 ; 40.33,44.2 40.45,44.09 v1(40.45,44.06) 40.45,43.94 U6.W4 ; 34.88,28.73 34.88,29.31 35.02,29.45 35.08,29.45 v1(35.22,29.6) ; 34.88,28.73 34.88,28.71 34.42,28.26 ; 34.88,28.73 34.88,28.72 ; 17.57,40.52 C47.1 ; 17.57,40.52 17.62,40.57 v1(18.06,40.57) ; 17.57,40.52 17.57,41.34 C115.1 17.46,41.62 C26.1 ; v1(5.86,36.83) 5.83,36.86 v1(5.83,37.47) 5.84,37.48 v1(5.84,38.14) 5.84,38.3 C100.2 ; 37.18,16.31 v1(37.18,15.85) ; 37.18,16.31 v1(37.64,16.31) ; 37.18,16.31 v1(37.18,16.77) ; v1(37.18,15.85) 37.18,15.39 ; v1(37.18,15.85) 37.63,15.85 37.64,15.87 ; 22.65,10.58 23.08,10.58 23.13,10.53 U2.C2 U2.C3 U2.C4 U2.B4 U2.B3 U2.B2 ; 32.13,25.96 31.67,25.96 U4.U7 ; 32.13,25.96 33.07,25.96 33.09,25.94 33.09,25.5 ; 32.13,25.96 32.13,26.85 32.06,26.92 ; 40.4,22.75 U4.L21 ; 40.4,22.75 U4.M21 ; 40.4,22.75 39.94,22.75 ; v1(25.68,24.59) 25.68,24.13 U4.AF3 ; v1(30.75,23.16) 30.75,23.66 ; v1(30.75,23.16) 30.75,22.71 ; v1(30.75,23.16) 30.88,23.16 30.88,23.16 31.21,23.16 ; 30.75,23.66 30.75,24.12 ; 30.75,23.66 31.16,23.66 31.21,23.71 ; v1(39.81,30.54) 40.38,30.54 40.39,30.55 ; v1(39.81,30.54) 39.81,30.8 40.03,31.02 40.4,31.02 ; v1(39.81,30.54) 39.5,30.54 39.48,30.56 ; U4.AG18 v1(32.13,16.31) ; U4.AG18 32.13,16.77 v1(32.59,16.77) ; U4.AG18 v1(32.13,17.23) ; 34.89,33.32 34.89,33.5 35.34,33.95 35.34,34.24 ; 38.96,8.15 38.67,8.15 v1(38.05,7.53) ; 10.33,42.51 9.98,42.51 9.98,45.21 v1(9.82,45.37) 9.28,45.91 ; C138.1 8.85,36.63 v1(8.85,35.98) ; 31.21,21.37 v1(30.75,21.37) U4.AC11 ; 31.21,21.37 v1(31.21,21.83) ; 31.21,21.37 31.66,21.37 31.67,21.36 ; U4.R26 41.33,18.62 v1(41.33,19.08) 41.77,19.08 U4.P26 v1(42.24,19.07) 42.24,19.54 ; v1(33.5,21.33) 33.09,21.33 33.05,21.37 ; v1(33.5,21.33) 33.92,21.33 33.96,21.37 ; v1(33.5,21.33) 33.5,20.92 33.51,20.91 ; 31.67,23.73 31.73,23.66 32.13,23.66 ; 31.67,23.73 31.67,23.71 ; 31.67,23.73 31.67,24.12 ; v1(35.44,47.89) 35.1,47.55 U6.K9 ; U4.Y9 31.21,25.02 ; U4.Y9 31.67,24.12 ; U4.Y9 31.21,23.71 ; U4.Y9 30.75,24.12 ; 31.21,25.02 30.76,25.02 30.76,24.6 U4.Y8 30.75,24.12 ; v1(28.31,35.06) 29.95,33.43 30.87,33.43 30.94,33.5 31.03,33.5 U4.K1 ; v1(39.15,32.29) 39.26,32.4 39.48,32.4 ; v1(39.15,32.29) 39.11,32.29 39.02,32.37 39.02,32.25 ; v1(39.15,32.29) 39.12,32.25 39.02,32.25 ; v1(6.17,21.06) 6.16,21.04 5.82,21.04 5.67,20.9 2.37,20.9 v1(2.28,20.99) 2.24,21.03 v1(2.24,22.41) ; 32.59,23.66 32.13,23.66 ; 32.13,23.66 32.13,23.21 ; 32.13,23.66 32.13,24.12 31.67,24.12 ; v1(33.19,38.83) 33.19,38.11 v1(34.93,36.38) 35.25,36.05 35.25,35.96 ; 37.21,13.09 U4.AE28 v1(37.64,12.63) ; 37.21,13.09 37.18,13.09 37.18,13.12 ; 37.21,13.09 37.18,13.12 ; 37.18,27.34 v1(37.18,27.8) ; 37.18,27.34 v1(37.64,27.34) ; 37.18,27.34 v1(37.18,26.88) ; 32.13,16.31 31.67,16.31 ; U4.L21 40.86,22.29 ; U4.L21 40.86,23.21 ; U4.L21 41.17,22.75 ; 40.86,22.29 U4.M21 ; 40.86,22.29 40.96,22.39 40.96,22.43 ; 40.86,22.29 U4.M22 ; v1(37.64,27.34) U4.K13 ; 34.42,25.5 34.53,25.61 34.53,25.96 33.96,25.96 33.96,25.96 33.96,25.47 ; 34.42,25.5 34.38,25.46 33.97,25.46 33.96,25.47 ; 34.42,25.5 U4.P12 35.34,25.96 ; 30.29,22.24 v1(30.29,21.83) U4.AC11 ; 30.29,22.24 30.29,22.72 v1(30.26,22.75) ; 30.29,22.24 30.7,22.24 v1(30.75,22.29) ; 30.29,22.24 29.87,22.24 v1(29.83,22.28) 29.83,22.75 v1(30.26,22.75) ; v1(25.85,50.77) 25.55,51.07 v1(25.55,53.47) C203.1 25.46,53.8 C148.1 ; v1(12.06,4.48) 12.06,3.72 12.08,3.7 ; U4.R18 37.64,22.74 37.65,22.75 37.64,22.75 U4.P17 v1(38.1,23.21) ; U4.R18 v1(37.18,22.29) ; 28.45,21.37 v1(27.99,21.37) ; U4.U10 33.09,25.09 33.09,25.5 ; v1(32.59,22.26) 33.03,22.26 33.05,22.24 33.05,22.75 ; v1(32.59,22.26) 32.59,21.82 32.58,21.83 32.15,21.83 ; v1(32.59,22.26) 32.56,22.29 32.13,22.29 ; v1(32.59,22.26) U4.Y12 ; v1(31.67,27.8) 31.2,27.8 31.21,27.79 U4.U6 ; v1(31.67,27.8) 31.67,26.92 ; v1(31.67,27.8) 32.13,27.8 ; v1(2.24,22.41) 2.73,22.41 X3.2 ; v1(2.24,22.41) 2.27,22.44 v1(2.27,23.66) 2.27,24.76 2.29,24.78 ; v1(38.56,24.58) U4.M16 v1(37.64,24.58) 37.18,24.58 ; v1(37.66,36.81) 37.55,36.69 37.55,35.98 37.18,35.61 ; 35.34,23.21 35.34,23.66 34.88,23.66 U4.U14 ; 35.34,23.21 U4.T15 ; 35.34,23.21 U4.U14 ; 35.34,23.21 U4.U15 ; v1(38.98,39.82) 38.94,39.87 38.94,40.41 ; 33.5,19.99 v1(33.97,19.99) ; 33.5,19.99 v1(33.5,20.45) ; 33.5,19.99 33.51,19.98 v1(33.51,19.53) ; 33.5,19.99 v1(33.05,19.99) ; v1(33.97,19.99) 33.97,19.99 33.97,20.45 ; v1(32.59,16.77) 32.59,17.23 U4.AF18 ; v1(32.59,16.77) 33.52,16.77 33.56,16.73 ; v1(40.16,27.54) 40.14,27.54 39.94,27.34 U4.F15 ; 32.13,29.92 v1(32.19,29.85) ; 32.13,29.92 31.73,30.32 31.73,30.95 31.67,31.02 ; v1(28,22.28) 28,22.6 27.57,23.03 27.57,23.16 27.53,23.21 ; 42.24,19.54 42.24,19.97 42.25,19.99 U4.M26 ; 42.24,19.54 42.66,19.54 42.7,19.51 U4.M26 ; 35.8,26.42 U4.N11 35.34,25.96 ; 35.8,26.42 35.8,26.43 35.8,26.88 ; 35.8,26.42 35.8,25.96 35.34,25.96 ; U6.N4 36.93,43.88 v1(36.92,43.89) ; 33.05,22.75 U4.W12 ; 33.05,22.75 U4.Y12 ; 35.8,23.2 35.86,23.26 35.86,24.07 U4.R14 ; 35.8,23.2 v1(35.8,22.75) ; 35.8,23.2 36.26,23.2 ; C18.1 11.49,35.92 v1(11.49,36.26) 11.49,36.85 11.57,36.93 ; 45.91,25.96 v1(46.37,25.96) ; v1(36.72,31.02) 36.72,30.56 36.93,30.56 37.18,30.31 37.14,30.27 37.14,30.14 37.18,30.1 ; U4.M21 40.14,22.03 ; GND.1 1.39,24.78 2.29,24.78 ; 32.13,27.8 32.13,28.26 32.12,28.27 32.58,28.27 32.59,28.26 32.59,27.79 32.57,27.8 32.13,27.8 ; 32.13,27.8 32.13,26.98 32.06,26.92 ; v1(33.97,20.91) 33.97,20.45 ; v1(33.97,20.91) U4.Y15 33.98,21.38 33.98,21.85 34,21.83 U4.W15 ; v1(33.97,20.91) 33.67,20.91 ; 33.96,20.45 v1(33.5,20.45) ; 32.15,21.38 32.16,21.37 v1(32.59,21.37) ; 32.15,21.38 32.15,21.83 ; 32.15,21.38 31.69,21.38 31.67,21.36 ; 32.15,21.38 32.15,20.93 v1(32.13,20.91) ; 37.18,15.39 37.61,15.39 ; 8.72,52.57 7.94,52.57 7.94,52.58 7.94,52.64 v1(7.55,53.03) ; 33.96,25.47 33.58,25.09 v1(33.58,25.08) 33.62,25.04 ; U4.AF21 v1(33.5,15.85) 33.5,16.31 ; U4.AF21 33.97,16.31 ; U4.AF21 34.42,15.85 v1(34.42,16.31) 33.97,16.31 ; U4.AF21 v1(33.97,15.39) ; 33.5,16.31 33.5,16.67 33.56,16.73 ; 33.5,16.31 33.96,16.31 ; U4.AB11 v1(30.75,22.29) ; U4.AB11 v1(31.67,22.29) ; U4.AB11 v1(31.21,21.83) ; U4.AB11 v1(31.21,22.74) 31.21,23.16 ; v1(30.75,22.29) 30.75,21.83 ; v1(30.75,22.29) 30.75,22.71 ; v1(31.67,22.29) 31.67,21.83 ; v1(31.67,22.29) 32.13,22.29 ; 40.35,23.66 40.4,23.71 U4.K19 40.91,24.12 ; 40.35,23.66 v1(39.48,23.66) U4.M18 ; 40.35,23.66 40.86,23.66 40.91,23.71 ; v1(43.3,42.65) 43.2,42.75 U6.AB3 ; 28.75,8.01 28.4,8.01 C134.1 ; 28.75,8.01 28.73,7.99 v1(28.73,7.66) ; 28.75,8.01 32.67,8.01 C342.1 ; 36.26,24.14 U4.R15 ; 36.26,24.14 36.7,24.14 U4.P15 ; 36.26,24.14 36.24,24.12 U4.R14 ; 33.03,42.75 32.8,42.98 v1(32.8,43.13) ; 36.28,27.36 36.31,27.39 ; 36.28,27.36 U4.L11 ; U6.W2 40.93,41.85 40.93,41.76 v1(41.18,41.5) 41.2,41.5 41.29,41.42 41.29,41.34 U6.Y1 ; U6.D2 31.08,41.89 v1(30.75,41.55) ; U4.U15 35.28,22.68 v1(34.89,22.68) ; U4.U15 v1(35.8,22.75) ; U4.U15 v1(35.34,22.29) ; R69.1 25.61,12.17 v1(25.48,12.17) ; v1(41.13,32.99) 40.99,32.99 U4.A10 ; 32.13,17.68 32.58,17.68 v1(32.59,17.69) ; 32.13,17.68 v1(31.67,17.68) 31.67,18.28 31.8,18.15 32.14,18.15 ; 32.13,17.68 v1(32.13,17.23) ; 2.29,24.78 2.52,25 4.95,25 v1(5,24.95) 5.26,24.95 C4.2 5,24.04 ; 33.96,22.75 U4.V13 33.5,23.21 ; 33.96,22.75 U4.W13 33.5,23.21 ; 33.96,22.75 U4.V14 ; 47.29,24.58 47.3,24.57 ; v1(38.68,28.17) 39.11,28.17 39.48,27.8 ; C122.1 18.02,45.44 18.02,45.58 18.46,46.02 C98.2 18.62,46.34 v1(19.13,46.34) 20.34,46.34 v1(20.4,46.29) 22.54,46.29 v1(22.72,46.1) ; 11.57,36.93 11.57,37.65 C85.2 11.57,38.62 C126.1 ; 11.57,36.93 11.62,36.98 ; 30.29,19.55 30.31,19.53 v1(30.75,19.53) ; 30.29,19.55 29.84,19.55 29.84,19.98 29.83,19.99 v1(29.37,19.99) U4.AF11 29.35,20.46 v1(28.9,20.46) ; 30.29,19.55 v1(30.29,19.07) U4.AF14 ; v1(40.68,40.09) 40.68,40.02 C182.2 ; v1(40.68,40.09) 40.21,40.09 C143.1 ; v1(40.68,40.09) 40.48,40.29 40.48,40.91 40.23,41.15 40.18,41.15 ; 33.05,19.54 33.03,19.53 v1(32.59,19.53) ; 33.05,19.54 v1(33.05,19.99) ; 33.05,19.54 33.06,19.53 v1(33.51,19.53) ; 33.97,16.31 U4.AE20 33.6,16.77 33.56,16.73 ; U4.AA24 v1(37.64,16.31) ; U4.AA24 U4.Y23 ; U4.AA24 v1(37.18,16.77) ; U4.AA24 v1(38.1,16.77) U4.Y24 38.1,17.66 38.13,17.69 ; v1(37.64,16.31) 37.64,15.87 ; U4.U1 28.76,29.33 v1(28.34,29.33) ; U4.L5 33.49,30.08 33.49,29.19 ; U4.J27 44.54,20.91 v1(44.54,21.36) 44.54,21.37 44.08,21.37 44.08,21.37 v1(44.08,21.83) ; 31.67,21.36 31.67,20.88 31.69,20.91 v1(32.13,20.91) ; 31.67,21.36 U4.AB12 ; U4.V22 38.1,18.37 ; 38.1,18.37 38.04,18.43 v1(37.67,18.43) 37.67,17.91 37.63,17.88 37.63,17.7 U4.Y23 ; 38.1,18.37 38.49,18.37 38.57,18.3 38.57,18.6 U4.V23 v1(39.02,18.61) U4.U23 ; v1(3.33,43.79) 3.33,43.78 C106.1 3.35,42.35 3.18,42.18 ; 37.18,13.55 37.18,13.12 ; 37.18,13.55 U4.AF26 ; 37.03,27.81 36.72,27.81 36.72,28.16 ; v1(26.62,22.74) 26.16,22.74 U4.AG5 ; U6.V8 40.54,46.4 41.37,46.4 v1(41.39,46.38) 41.48,46.47 U6.Y8 ; 40.4,31.02 40.86,31.02 ; 40.4,31.02 40.39,31.01 40.39,30.56 ; v1(35.8,22.75) U4.U16 ; v1(7.55,53.03) 7.55,52.97 7.13,52.56 ; v1(7.55,53.03) 7.55,53.02 v1(6.66,53.02) 6.56,52.92 6.56,52.85 6.14,52.43 4.42,52.43 C108.1 ; 31.67,26.92 32.06,26.92 ; 31.67,26.92 31.7,26.88 ; 30.75,22.71 30.71,22.75 v1(30.26,22.75) ; 41.34,22.77 41.34,23.21 ; 41.34,23.21 U4.J22 42.24,22.67 42.16,22.75 v1(41.32,22.75) ; 41.34,23.21 40.86,23.21 ; v1(37.64,26.42) U4.L14 ; v1(37.64,26.42) U4.K13 ; v1(37.64,26.42) 37.18,26.42 ; U4.AH23 33.07,13.12 32.13,13.12 v1(31.87,12.85) ; v1(32.59,19.53) U4.AC15 ; v1(32.59,19.53) U4.AE17 ; U4.G12 38.56,28.76 ; 38.56,28.76 38.55,28.76 ; U4.AB12 v1(31.21,21.83) ; U4.AB12 32.15,21.83 ; v1(31.21,21.83) U4.AC11 ; v1(37.44,32.12) 37.41,32.12 37.18,32.35 ; v1(38.05,7.53) v1(39.38,6.19) 39.83,5.75 40.3,5.75 v1(40.49,5.94) v1(42.28,7.73) ; v1(38.05,7.53) 37.87,7.7 C20.2 ; v1(33.05,19.99) U4.AC15 ; U4.P15 36.74,24.11 36.74,23.63 36.7,23.66 U4.R15 ; U4.P15 37.18,24.12 37.18,24.58 ; 31.7,26.88 U4.U6 ; 31.7,26.88 31.7,26.46 U4.U7 ; 40.91,24.99 40.91,24.12 ; 40.91,24.12 40.91,23.71 ; 40.91,24.12 U4.J20 ; v1(33.05,17.24) 32.59,17.24 U4.AF18 ; U6.T12 38.59,50.25 38.59,50.31 38.59,50.31 v1(38.59,50.53) ; v1(38.53,54.57) v1(37.75,54.57) v1(36.62,54.57) 36.59,54.59 v1(35.56,54.59) 35.5,54.65 C207.2 ; v1(35.2,33.91) 35.2,34.05 35.24,34.09 35.24,34.15 35.34,34.24 ; U4.W15 v1(34.42,22.28) ; U4.W15 v1(34.88,21.83) ; U4.U26 40.41,17.68 v1(40.41,17.22) 39.95,17.22 U4.V26 39.93,17.24 39.93,17.7 40.39,17.7 U4.U26 ; U4.U26 40.86,17.69 v1(40.86,17.68) ; 40.39,30.55 U4.C12 40.39,30.56 ; 40.39,30.55 v1(40.39,30.26) ; 40.39,30.55 40.39,30.56 ; 40.86,23.21 40.91,23.25 40.91,23.71 ; U4.J3 33.51,31.95 33.51,32.12 33.78,32.39 33.96,32.39 U4.H3 34,32.43 v1(34,32.86) 33.51,32.86 U4.H2 ; 37.16,30.01 37.16,30.1 37.18,30.1 ; v1(32.6,20.45) 32.6,20 U4.AC15 ; v1(32.6,20.45) 32.6,20.89 U4.AB14 ; U4.R14 35.34,24.12 U4.T14 ; 12.19,52.05 12.86,52.05 C77.2 ; U4.M18 v1(38.56,23.66) U4.N17 v1(38.1,23.21) ; U4.M18 v1(39.02,23.21) U4.N18 v1(38.1,23.21) ; C96.2 8.42,40.19 R58.2 ; U6.G8 33.03,46.9 v1(32.78,47.16) ; U4.M6 33.51,29.19 v1(33.51,29.65) ; v1(31.39,49.53) 31.08,49.22 U6.D11 ; U6.G12 33.03,50.01 v1(33.42,50.39) ; U4.V14 34.82,22.75 v1(34.89,22.68) ; U4.V14 34.42,23.2 ; v1(16.34,44.17) 16.34,44.01 C92.2 ; v1(43.61,28.71) 44.07,28.71 U4.A18 ; v1(35.34,22.29) 34.88,22.29 v1(34.88,21.83) ; v1(35.34,22.29) U4.U16 ; v1(35.34,22.29) U4.V16 ; 31.21,23.16 31.21,23.71 ; 31.21,23.16 31.62,23.16 31.67,23.21 ; v1(37.18,26.88) U4.K13 ; v1(37.18,26.88) 37.18,26.42 ; 32.13,23.21 32.13,22.75 U4.Y12 ; 32.13,23.21 U4.W12 ; 32.13,23.21 32.1,23.17 31.7,23.17 31.67,23.21 ; 39.02,32.25 U4.C9 ; 39.02,32.25 38.88,32.4 U4.C8 ; C335.1 15.29,4.14 C341.1 ; 34.97,41.95 34.85,41.95 34.33,41.44 U6.J1 34.33,41.12 ; 35.34,34.24 35.57,34.47 ; U6.E5 v1(31.35,43.97) ; 37.18,26.42 37.18,25.96 ; 37.18,26.42 36.72,26.42 36.72,25.96 ; 37.18,25.96 37.18,25.5 ; 37.18,25.96 36.72,25.96 ; 39.94,21.37 40.38,21.37 ; 39.94,21.37 39.48,21.37 ; 39.94,21.37 40.03,21.46 40.03,21.92 ; 40.38,21.37 40.82,21.37 40.86,21.33 U4.M22 ; 40.38,21.37 40.38,21.8 40.35,21.83 U4.M22 ; 35.83,34.47 35.57,34.47 ; 35.83,34.47 v1(35.88,34.52) 35.96,34.52 36.13,34.7 U4.C3 ; 35.83,34.47 35.8,34.44 U4.D3 ; 35.57,34.47 U4.D2 ; U6.D9 31.08,47.56 v1(30.69,47.95) ; v1(38.11,46) 38.44,46.32 38.45,46.32 38.88,46.75 ; U4.U7 v1(31.21,26.42) U4.U6 ; U4.AF18 v1(32.13,17.23) ; U4.AF18 v1(32.59,17.69) ; C114.1 2.8,50.2 2.43,49.83 2.43,49.04 v1(2.93,48.53) ; U4.Y23 38.13,17.69 ; 31.67,23.71 31.67,23.21 31.67,23.21 ; 31.67,23.71 31.21,23.71 ; v1(32.13,20.91) U4.AB14 ; 15.49,52.05 15.52,52.07 ; C107.2 3.35,44.77 C118.1 2.94,45.79 v1(2.94,46.24) ; v1(22.44,12.03) 22.44,12.17 23.28,13.01 C137.1 ; v1(36.2,49.9) 36.2,49.87 v1(36.63,49.44) 36.8,49.26 36.82,49.26 U6.N11 ; v1(35.35,31.5) 35.65,31.5 35.8,31.64 v1(35.8,31.95) 35.8,31.94 U4.G6 35.36,31.48 35.34,31.49 ; U4.R23 v1(39.94,19.53) ; 32.15,21.83 32.15,22.26 32.13,22.29 ; v1(12.1,55.02) 11.99,54.91 11.93,54.91 11.8,54.78 11.8,54.72 11.39,54.31 v1(11.39,54.27) ; v1(12.1,55.02) 11.69,55.43 v1(11.54,55.43) ; U6.K11 35.37,49.54 v1(35.45,49.54) ; U4.M22 v1(41.32,21.83) ; U4.W12 33.5,23.21 ; U3.H10 v1(51.18,46.36) ; U4.V3 29.38,27.81 v1(29.82,27.81) ; U4.R3 v1(30.29,29.18) ; U4.U6 v1(30.75,26.88) ; U4.R15 36.26,23.21 ; U4.A14 42.24,30.57 42.61,30.95 43.4,30.95 v1(43.44,30.91) ; C339.1 16.92,11.24 v1(16.65,11.24) ; v1(34.8,38.08) 35.39,38.08 36.2,37.27 v1(36.2,37.03) 36.2,36.6 U4.A1 ; v1(37.18,22.29) 37.18,21.83 ; v1(37.18,22.29) 37.18,22.75 ; U4.V16 v1(35.34,21.37) U4.W17 U4.Y18 ; U4.V16 v1(34.88,21.83) ; U4.V16 v1(35.8,21.83) ; v1(55.82,40.47) 55.57,40.22 55.57,39.05 55.26,38.74 R76.1 ; U4.AF14 v1(30.75,19.53) ; 37.18,17.23 v1(37.18,16.77) ; 38.13,17.69 38.49,17.69 38.57,17.77 v1(38.57,18.21) ; v1(35.8,30.11) 35.8,29.65 U4.J8 ; 37.61,15.39 37.64,15.43 ; C59.1 7.52,22.83 7.53,22.82 8.14,22.82 U9.41 9,22.69 v1(9.41,22.28) ; v1(42.28,7.73) 42.85,8.3 42.85,8.87 40.88,10.84 v1(40.03,10.84) 39.36,10.84 38.91,11.28 ; v1(42.28,7.73) 42.28,7.94 U1.4 ; U4.AB14 v1(32.59,21.37) ; 35.34,31.49 35.34,31.02 ; 35.34,31.49 U4.G5 ; 33.05,21.37 v1(32.59,21.37) ; v1(32.59,17.69) U4.AE17 ; U4.AE14 v1(30.75,19.53) ; U4.AF17 32.14,17.71 32.14,18.15 ; U6.AB8 v1(43.16,47.13) ; U4.AB6 28.9,24.59 v1(28.49,24.59) ; U4.U14 34.42,23.21 ; U4.U14 34.89,23.2 v1(34.89,22.68) ; v1(16.51,10.24) 16.63,10.36 17.23,10.36 C340.1 ; v1(39.06,35.99) 39.06,34.73 U4.A6 ; v1(27.33,49.63) 27.17,49.47 C146.1 ; C90.2 15.14,42.67 v1(14.75,43.06) ; U6.J12 34.33,49.99 v1(34.66,50.32) ; C24.1 15.04,52.31 v1(15.04,52.77) 15.04,53.5 C111.1 15.36,53.52 15.43,53.59 16.47,53.59 16.54,53.52 18.38,53.52 C45.1 ; 32.14,18.15 U4.AE17 ; 42.24,21.37 v1(42.7,21.37) ; USBC1.B12 USBC1.A1 7.46,10.08 USBC1.0 ; 37.18,32.35 37.18,31.94 ; LED1.1 5.33,1 5.95,1.62 6.12,1.62 USBC1.1 6.69,2.4 USBC1.A12 USBC1.B1 ; 38.9,48.51 v1(39.12,48.74) ; U4.F9 37.18,30.1 ; 37.64,15.87 37.64,15.43 ; v1(41.83,43.97) 41.48,44.32 U6.Y5 ; v1(46.37,25.05) 46.37,24.59 46.37,24.58 U4.B26 ; 15.57,52.32 15.57,52.24 15.39,52.06 14.13,52.06 ; U4.C18 v1(43.16,28.26) 42.7,28.26 U4.B16 v1(42.24,29.18) 42.13,29.28 41.88,29.28 U4.C15 41.76,29.2 41.76,29.37 41.5,29.62 41.34,29.62 U4.C14 ; v1(30.43,45.91) 30.43,45.92 30.43,46.76 ; v1(44.5,19.28) 44.52,19.28 44.65,19.15 44.31,19.15 43.89,18.73 43.27,18.73 U4.N28 ; C127.1 15.51,39.67 v1(16.35,38.82) ; U4.U16 v1(35.8,21.83) ; U4.U16 35.85,22.29 ; U6.G10 v1(32.65,48.73) ; v1(36.63,47.94) 36.93,47.63 U6.N9 ; 36.72,28.16 v1(36.72,28.26) 36.78,28.2 36.72,28.16 ; v1(34.72,48.77) 34.33,48.39 U6.J10 ; U6.P12 37.58,50.11 v1(37.32,50.38) ; U6.T10 38.88,48.5 38.89,48.51 ; U6.V12 40.18,50.74 v1(40.24,50.81) ; v1(31.48,51.78) 30.43,50.73 U6.C12 ; U4.A28 48.89,24.12 49.6,24.84 49.61,24.84 49.66,24.89 50,24.89 50.21,25.1 v1(50.42,25.1) ; 36.07,27.27 v1(35.8,27.27) 35.8,26.89 ; U6.P3 37.58,42.65 36.9,41.96 ; U6.W11 41.48,49.8 U6.Y12 41.51,49.98 41.51,50.25 41.76,50.49 v1(41.76,50.52) ; v1(38.77,44.99) 38.88,44.88 U6.T5 ; v1(52.28,47.91) 52.28,47.72 52.49,47.51 52.49,47.5 U3.K8 ; U4.P3 v1(31.21,30.1) ; U6.C5 v1(30.05,43.97) ; U6.W9 v1(41.21,47.93) ; U4.AH8 v1(26.61,20.91) ; U6.K4 v1(34.58,43.95) ; U4.M26 v1(43.16,19.99) U4.L26 42.7,20.45 42.7,19.99 U4.M26 ; U4.B5 37.63,34.24 v1(37.63,34.7) ; v1(54.66,46.92) 54.19,46.92 U3.J5 ; v1(44.54,23.21) 44.08,23.21 U4.G24 ; 37.18,19.99 v1(37.18,19.53) ; v1(32.09,50.39) 31.73,50.03 U6.E12 ; 29.67,54.66 29.63,54.63 v1(28.71,54.63) ; U6.N2 v1(37.36,41.52) ; U3.G5 54.28,45.72 54.28,45.72 54.53,45.46 v1(54.6,45.46) ; U6.D4 v1(30.7,43.17) ; v1(3.56,39.62) 3.29,39.35 3.19,39.35 ; U3.E7 53.28,44.72 53.28,44.71 53.49,44.5 53.78,44.5 53.8,44.52 54.28,44.52 54.57,44.81 v1(54.62,44.81) 54.51,44.7 54.49,44.7 54.29,44.5 54.29,44.19 54.62,43.87 54.62,43.86 U3.C4 ; U6.E8 31.73,46.9 v1(31.5,47.13) ; v1(27.34,26.13) 27.34,26.16 U4.AB2 ; v1(30.5,39.4) 30.07,39.83 30,39.83 29.87,39.95 29.87,40.74 30.28,41.15 U6.C1 ; 28.45,25.96 28.45,25.96 27.97,25.96 v1(27.59,25.58) ; 36.26,11.71 v1(36.26,11.26) ; 36.93,49.15 37.58,48.5 U6.P10 ; 38.88,42.75 v1(39.28,42.35) ; U4.D28 v1(47.75,22.75) ; R167.1 10.67,7.72 v1(9.87,7.72) ; v1(54.54,49.79) 54.63,49.69 U3.P4 ; C55.1 4.99,29.09 v1(4.96,29.06) ; U4.M11 35.85,26.93 ; U4.AD3 v1(26.15,25.04) ; 34.42,31.02 v1(34.42,31.48) ; U6.A10 v1(28.75,48.73) ; U6.G5 v1(33.43,43.95) ; 34.33,42.75 v1(33.93,42.35)
  Bottom Layer w0.102: v1(36.92,39.4) 36.92,39.71 36.51,40.11 36.51,42.55 36.53,42.56
  Bottom Layer w0.127: v1(36.92,43.89) 36.53,43.5 ; 36.53,43.5 36.53,46.46 35.64,47.35 35.6,47.35 35.32,47.63 C163.2 ; 36.53,43.5 36.53,42.56 ; 51.31,29.48 51.31,29.3 51.03,29.02 51.03,28.56 51.08,28.51 ; v1(44.54,21.36) 45.15,20.75 R19.2
  Bottom Layer w0.152: v1(36.2,37.03) 35.78,37.45 35.78,45.35 35.52,45.61 v1(35.52,45.79) ; v1(54.91,10.16) 56,10.16 56.97,11.13 56.97,21.1 57,21.14 ; C56.1 42.62,24.18 41.82,24.18 C53.1 ; v1(53.26,27.7) 53.17,27.61 53.17,25.25 51.03,23.11 48.38,23.11 48.24,22.97 ; v1(41.39,46.38) 41.75,46.38 41.94,46.18 45.19,46.18 v1(45.43,45.94) ; 57.77,12.12 57.77,15.38 57.73,15.42 57.73,15.99 57.77,16.03 57.77,16.13 ; 45.15,34.79 45.09,34.73 45.09,34.69 40.97,30.58 40.56,30.58
  Bottom Layer w0.203: 57,21.14 57.29,21.42 57.6,21.42 v1(57.74,21.56) ; v1(52.73,28.25) 52.67,28.18 52.67,25.43
  Bottom Layer w0.254: C21.1 36.26,11.05 v1(36.26,11.26) ; C186.1 54.97,51.25 v1(54.96,51.25) ; v1(56.13,18.33) 56.11,18.35 CN5.31 ; 55.61,23.15 55.94,23.15 56.15,22.94 ; CN4.87 5.78,18.73 6.11,18.73 6.24,18.86 6.24,19.64 6.11,19.77 5.78,19.77 CN4.81 5.61,19.93 5.27,19.93 5.14,20.06 5.14,22.04 5.27,22.17 5.27,22.33 ; v1(39.94,19.53) 40.2,19.79 C42.1 39.48,20.64 C31.1 ; v1(56.13,14.74) 56.12,14.75 CN5.13 ; C1.1 38.28,26.71 v1(38.1,26.88) ; C13.1 34.89,22.8 v1(34.89,22.68) ; CN4.122 2.98,11.31 USBC1.3 ; 56.15,22.94 56.15,24.14 56.03,24.27 55.69,24.27 CN5.61 ; 56.15,22.94 56.15,22.71 v1(56.27,22.59) 56.15,22.47 56.15,22.16 56.03,22.03 55.72,22.03 55.63,21.95 55.61,21.95 ; 35.37,20.44 35.37,21.34 v1(35.34,21.37) ; 2.92,17.51 2.98,17.45 ; 2.92,17.51 v1(2.25,17.51) ; 2.92,17.51 5.63,17.51 CN4.93 ; v1(35.8,22.75) 35.8,23.07 C11.1 35.48,24.26 C12.1 ; v1(56.53,49.64) 56.53,49.75 C184.2 ; 10.28,46.91 11.53,48.16 C95.1 ; C38.1 34.39,26.08 34.07,26.08 33.93,26.23 33.93,26.62 33.43,26.62 33.35,26.71 33.35,27.02 v1(33.04,27.33) ; C38.1 34.39,25.89 33.63,25.13 ; C38.1 34.53,25.86 34.53,25.83 34.81,25.56 C29.1 ; CN4.107 CN4.105 5.64,15.1 2.93,15.1 ; R12.2 37.08,21.08 36.94,21.08 36.86,21 C61.1 ; R12.2 37.33,21.2 37.57,20.96 37.57,20.91 C44.1 38.1,20.79 C49.1 ; R12.2 37.19,21.36 v1(36.72,21.83) v1(37.18,22.29) ; CN5.12 CN5.10 CN5.4 CN5.2 58.02,12.35 57.92,12.25 57.9,12.25 57.77,12.12 57.77,11.65 57.9,11.52 57.93,11.52 58.14,11.32 v1(58.32,11.32) ; v1(40.14,21.98) 40.14,21.51 C43.1 ; v1(34.42,22.28) 34.42,22.31 C64.1 ; CN4.113 5.61,13.53 5.27,13.53 4.97,13.84 2.97,13.84 ; 10.28,44.91 10.33,44.91 C73.1 10.92,44.31 C76.2 ; 2.97,13.84 CN4.112 ; 2.97,13.84 v1(2.4,13.84) ; v1(54.21,29.72) 54.84,30.35 CN5.91 ; CN5.101 54.92,32.35 v1(54.91,32.36) 54.19,32.36 51.31,29.48 ; CN4.99 5.69,16.25 v1(2.33,16.25) ; C188.1 56.84,45.29 v1(56.53,45.6) ; v1(6.17,21.06) 6.16,21.05 CN4.75 ; 5.27,22.33 5.61,22.33 CN4.69 ; 5.27,22.33 5.14,22.46 5.14,22.8 4.91,23.03 4.91,23.89 ; 51.18,46.34 C189.1 ; 51.18,46.34 v1(51.18,46.36) ; 51.18,46.34 50.92,46.59 50.88,46.59 50.44,47.03 50.44,47.82 50.78,48.15 C191.1 ; 51.18,46.34 v1(51.18,44.97) 51.18,44.57 51.3,44.45 ; USBC1.0 6.63,10.84 CN4.121 CN4.119 5.61,12.33 5.27,12.33 4.96,12.65 CN4.118 2.9,12.57 2.56,12.57 2.26,12.27 v1(2.19,12.27) ; C79.1 8.29,44.9 8.28,44.91 7.57,44.2 6.62,44.2 ; v1(33.51,19.53) 34.36,19.53 R32.2 ; v1(56.09,19.56) 56.08,19.55 55.61,19.55 ; v1(52.73,28.25) 54.21,29.72 ; C70.1 33.63,25.13 ; 33.63,25.13 33.69,25.13 33.65,25.08 v1(33.58,25.08) 33.63,25.13 ; 55.61,17.15 56.1,17.15 v1(56.11,17.14) ; CN5.43 56.09,20.75 v1(56.09,20.76) 56.09,20.6 56.15,20.54 56.15,12.56 56.09,12.5 56.09,12.38 v1(56.06,12.34) 56.04,12.35 CN5.1 ; 55.61,13.55 56.06,13.55 ; C69.1 34.24,20.26 v1(33.97,19.99) ; v1(45.24,39.5) 45.24,34.89 45.17,34.81 ; 41.82,24.2 41.39,24.64 v1(41.33,24.64) 41.7,25.01 41.82,25.01 ; v1(53.26,27.7) 53.26,27.82 v1(54.89,29.44) 54.91,29.47 54.91,29.55 55.61,29.55 ; 55.61,31.55 55.57,31.52 v1(54.91,31.52) 54.47,31.52 51.78,28.83 v1(51.78,27.33) 51.78,25.94 ; v1(32.59,22.26) 32.71,22.39 C71.1 ; 2.93,15.1 CN4.106 ; 2.93,15.1 v1(2.3,15.1) ; v1(2.24,22.41) 2.38,22.41 2.42,22.37 2.53,22.37 2.56,22.33 2.9,22.33 CN4.70 ; CN5.54 58.34,22.72 v1(59.32,22.72) ; 51.08,28.51 50.89,28.32 50.89,27.26 v1(50.95,27.2) 50.89,27.14 50.89,25.57 v1(50.42,25.1) ; v1(39.02,18.61) 39.3,18.89 39.3,19.04 ; 48.24,22.97 48.01,22.75 v1(47.75,22.75) ; v1(1.68,34.55) 1.78,34.65 CN4.8 ; v1(38.57,18.21) 38.57,18.27 38.16,18.68 ; CN4.57 5.3,24.65 v1(5,24.95) 4.91,24.86 4.91,23.89 ; 4.91,23.89 5.27,23.53 5.61,23.53 CN4.63 ; C60.1 36.2,21.43 v1(35.8,21.83) ; CN4.88 2.93,18.6 v1(2.28,18.6) ; 57.77,16.13 57.77,20.14 57.98,20.35 CN5.42 58.33,20.33 v1(59.67,20.33) ; v1(37.18,19.53) 36.88,19.22 C30.1 ; v1(31.21,25.5) 31.35,25.5 31.82,25.03 ; C89.1 7.95,47.25 8.28,46.91 ; C8.1 37.35,26.13 v1(37.64,26.42) 37.66,26.42 C3.1 ; v1(57.74,21.56) 57.75,21.55 58.32,21.55 ; 58.32,23.95 58.35,23.92 v1(59.39,23.92) ; CN5.82 58.38,28.41 v1(59.32,28.41)
  vias: v1(2.93,47.17) v1(3.43,54.97) v1(5.35,54.83) v1(6.88,39.04) v1(7.67,46.45) v1(7.85,37.85) v1(8.84,46.42) v1(9.43,39.44) v1(9.82,46.47) v1(9.9,4.74) v1(10.93,46.4) v1(11,45.32) v1(11.49,1.23) v1(11.52,36.88) v1(11.84,37.74) v1(12.09,35.97) v1(13.05,7.08) v1(13.02,6.45) v1(13.67,6.43) v1(14.29,6.45) v1(14.34,7.09) v1(15.31,3.53) v1(15.73,2.75) v1(15.85,4.2) v1(16.01,45.05) v1(17.12,53.09) v1(17.71,53.44) v1(18.54,41.4) v1(21.75,46.44) v1(21.74,44.07) v1(21.73,36.73) v1(22.72,45.28) v1(22.74,42.18) v1(22.73,39.37) v1(22.72,38.49) v1(22.72,34.28) v1(23.78,41.77) v1(23.78,40.08) v1(23.78,37.08) v1(23.82,43.37) v1(24.85,45.2) v1(25.88,39.72) v1(26.23,45.55) v1(27.22,44.96) v1(27.37,30.13) v1(27.62,34.2) v1(27.73,42.9) v1(27.73,41.25) v1(28.02,37.11) v1(28.03,32.15) v1(28.66,37.81) v1(28.95,45.39) v1(29.49,40) v1(29.57,7.74) v1(29.63,38.28) v1(29.72,36.77) v1(30.1,52.01) v1(30.42,7.64) v1(30.95,45.52) v1(31.12,32) v1(31.84,36.06) v1(31.81,34.74) v1(32.28,38.52) v1(32.49,37.77) v1(33.48,31.49) v1(33.91,46.15) v1(38.22,39.65) v1(38.46,37.89) v1(39.06,38.92) v1(40.58,51.93) v1(41.06,38.38) v1(41.62,45.39) v1(42.14,26.08) v1(42.24,38.09) v1(43.22,37.56) v1(44.23,38.63) v1(44.22,34.99) v1(44.73,49.83) v1(45.42,44.42) v1(46.09,30.87) v1(47.19,49.28) v1(47.81,44.62) v1(47.72,37.44) v1(48.49,33.23) v1(49.6,36.95) v1(50.55,41.44) v1(54.15,18.47) v1(54.17,13.27) v1(54.24,17.1) v1(54.29,15.65) v1(54.34,14.24) v1(54.89,11.78) v1(56.09,15.94) v1(56.06,13.55) v1(57.19,23.52)
